# Altium project usb-pd-240w.PrjPcb
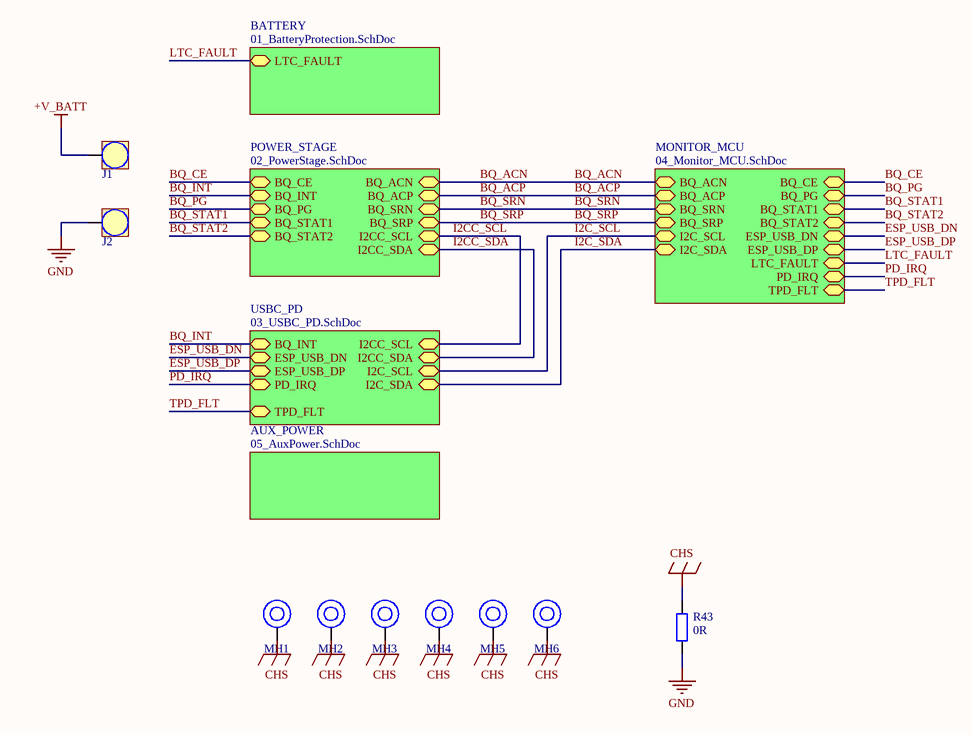
[diagram p0: 00_Top.SchDoc]
6 sheets, 154 parts. Net scope: hierarchical (ports join the sheet entries above them; power ports are global).
Board file: USB-PD-240W-PCB.PcbDoc
Sheets:
  00_Top.SchDoc
    BATTERY = 01_BatteryProtection.SchDoc
    POWER_STAGE = 02_PowerStage.SchDoc
    USBC_PD = 03_USBC_PD.SchDoc
    MONITOR_MCU = 04_Monitor_MCU.SchDoc
    AUX_POWER = 05_AuxPower.SchDoc

## Sheet 00_Top.SchDoc
size A3; SheetNumber: 1; SheetTotal: 6

### Parts
J1  7460408  [7460408_HAL Surface]  (value not drawn)
J2  7460408  [7460408_HAL Surface]  (value not drawn)
MH1  Mounting-Hole  [MH3.0x7.6]  (value not drawn)  (no BOM)
MH2  Mounting-Hole  [MH3.0x7.6]  (value not drawn)  (no BOM)
MH3  Mounting-Hole  [MH3.0x7.6]  (value not drawn)  (no BOM)
MH4  Mounting-Hole  [MH3.0x7.6]  (value not drawn)  (no BOM)
MH5  Mounting-Hole  [MH3.0x7.6]  (value not drawn)  (no BOM)
MH6  Mounting-Hole  [MH3.0x7.6]  (value not drawn)  (no BOM)
R43  0R  [RESC1608X06N]

### Sub-sheets
AUX_POWER = 05_AuxPower.SchDoc: no entries
BATTERY = 01_BatteryProtection.SchDoc: LTC_FAULT (bidir)
MONITOR_MCU = 04_Monitor_MCU.SchDoc: BQ_ACN (bidir), BQ_ACP (bidir), BQ_SRN (bidir), BQ_SRP (bidir), I2C_SCL (bidir), I2C_SDA (bidir), BQ_CE (bidir), BQ_PG (bidir), BQ_STAT1 (bidir), BQ_STAT2 (bidir), ESP_USB_DN (bidir), ESP_USB_DP (bidir), LTC_FAULT (bidir), PD_IRQ (bidir), TPD_FLT (bidir)
POWER_STAGE = 02_PowerStage.SchDoc: BQ_ACN (bidir), BQ_ACP (bidir), BQ_SRN (bidir), BQ_SRP (bidir), I2CC_SCL (bidir), I2CC_SDA (bidir), BQ_CE (bidir), BQ_INT (bidir), BQ_PG (bidir), BQ_STAT1 (bidir), BQ_STAT2 (bidir)
USBC_PD = 03_USBC_PD.SchDoc: I2CC_SCL (bidir), I2CC_SDA (bidir), I2C_SCL (bidir), I2C_SDA (bidir), BQ_INT (bidir), ESP_USB_DN (bidir), ESP_USB_DP (bidir), PD_IRQ (bidir), TPD_FLT (bidir)

### Nets
+V_BATT: J1.1
CHS: MH1.1 MH2.1 MH3.1 MH4.1 MH5.1 MH6.1 R43.2
GND: J2.1 R43.1
BQ_ACN: sheet POWER_STAGE/BQ_ACN, sheet MONITOR_MCU/BQ_ACN
BQ_ACP: sheet POWER_STAGE/BQ_ACP, sheet MONITOR_MCU/BQ_ACP
BQ_CE: sheet POWER_STAGE/BQ_CE, sheet MONITOR_MCU/BQ_CE
BQ_INT: sheet POWER_STAGE/BQ_INT, sheet USBC_PD/BQ_INT
BQ_PG: sheet POWER_STAGE/BQ_PG, sheet MONITOR_MCU/BQ_PG
BQ_SRN: sheet POWER_STAGE/BQ_SRN, sheet MONITOR_MCU/BQ_SRN
BQ_SRP: sheet POWER_STAGE/BQ_SRP, sheet MONITOR_MCU/BQ_SRP
BQ_STAT1: sheet POWER_STAGE/BQ_STAT1, sheet MONITOR_MCU/BQ_STAT1
BQ_STAT2: sheet POWER_STAGE/BQ_STAT2, sheet MONITOR_MCU/BQ_STAT2
ESP_USB_DN: sheet USBC_PD/ESP_USB_DN, sheet MONITOR_MCU/ESP_USB_DN
ESP_USB_DP: sheet USBC_PD/ESP_USB_DP, sheet MONITOR_MCU/ESP_USB_DP
I2C_SCL: sheet USBC_PD/I2C_SCL, sheet MONITOR_MCU/I2C_SCL
I2C_SDA: sheet USBC_PD/I2C_SDA, sheet MONITOR_MCU/I2C_SDA
I2CC_SCL: sheet POWER_STAGE/I2CC_SCL, sheet USBC_PD/I2CC_SCL
I2CC_SDA: sheet POWER_STAGE/I2CC_SDA, sheet USBC_PD/I2CC_SDA
LTC_FAULT: sheet BATTERY/LTC_FAULT, sheet MONITOR_MCU/LTC_FAULT
PD_IRQ: sheet USBC_PD/PD_IRQ, sheet MONITOR_MCU/PD_IRQ
TPD_FLT: sheet USBC_PD/TPD_FLT, sheet MONITOR_MCU/TPD_FLT

### Library data of the parts
J1 J2 = 7460408: TERM REDCUBE M5 12PIN PCB; Manufacturer 1: Würth Elektronik; Brand: Wurth; Case Style: M5Bush; Brand Number: 7460408; Order Code Supplier: 1821279; Price: 4,17; Supplier: Farnell; Part Name: 7460408; Supplier 1: Digi-Key; Supplier Part Number 1: 732-7460408-ND; Manufacturer Part Number 1: 7460408
MH1-MH6 = Mounting-Hole: MOUNTING HOLE 3.0x7.6MM; Part Name: Mounting-Hole
R43 = ERJ-3GEY0R00V: RES SMD 0 OHM JUMPER 1/10W 0603; Manufacturer 1: Panasonic Electronic Components; AEC-Q200: True; Power (Watts): 0.1W, 1/10W; Resistance: 0 Ohms; Case Code (Imperial): 0603; Manufacturer Part Number 1: ERJ-3GEY0R00V; Part Name: ERJ-3GEY0R00V; Supplier 1: Digi-Key; Supplier Part Number 1: P0.0GCT-ND; Tolerance: Jumper

## Sheet 01_BatteryProtection.SchDoc
size A3; SheetNumber: 2; SheetTotal: 6
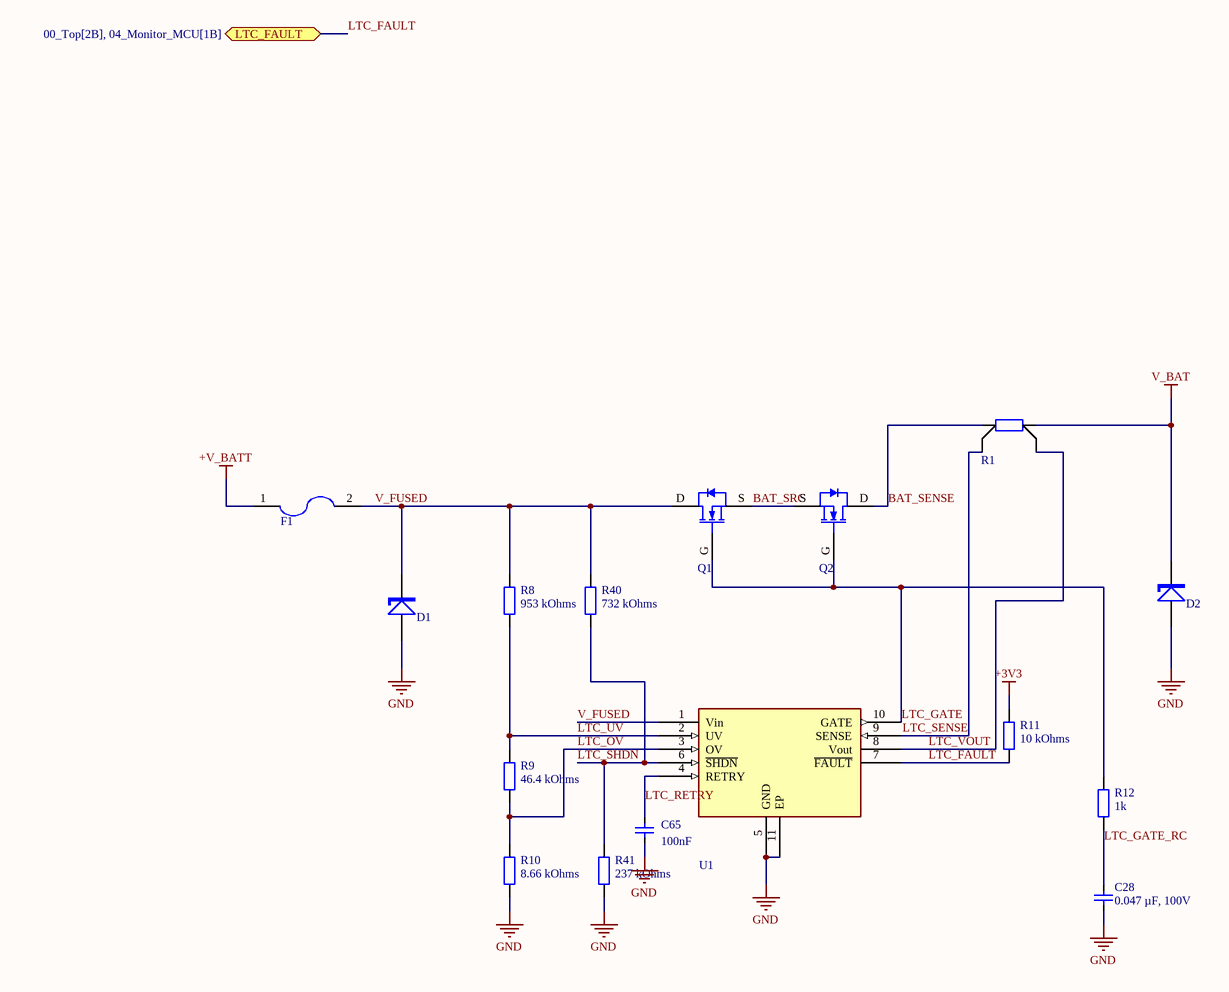
[diagram p1: 01_BatteryProtection.SchDoc]

### Parts
C28  0.047 µF, 100V  [CAPC1608X10N]
C65  100nF  [CAPC1608X10N]
D1  SMBJ60A  [SMB]  (value not drawn)
D2  SMBJ60A  [SMB]  (value not drawn)
F1  30A  [FUSE_BEL_0678H_3912]  (value not drawn)
Q1  ISC022N10NM6ATMA1  [INF-PG-TSON-8-3]  (value not drawn)
Q2  ISC022N10NM6ATMA1  [INF-PG-TSON-8-3]  (value not drawn)
R1  1.5m  [WSL3637]  (value not drawn)
R8  953 kOhms  [RESC1005X04N]
R9  46.4 kOhms  [RESC1005X04N]
R10  8.66 kOhms  [RESC1005X04N]
R11  10 kOhms  [RESC1005X04N]
R12  1k  [RESC1005X04N]
R40  732 kOhms  [RESC1005X04N]
R41  237 kOhms  [RESC1005X04N]
U1  LTC4368IDD-1#PBF  [LT-DD-DFN10_3X3]  (value not drawn)

### Ports
LTC_FAULT (bidir, see 00_Top[2B], 04_Monitor_MCU[1B])

### Nets
+3V3: R11.2
+V_BATT: F1.1
GND: C28.1 C65.1 D1.A D2.A R10.1 R41.1 U1.5(GND) U1.11(EP)
V_BAT: D2.K R1.2
BAT_SENSE: Q2.D(Drain) R1.1
BAT_SRC: Q1.S(Source) Q2.S(Source)
LTC_FAULT: R11.1 U1.7(~{FAULT}) ; port LTC_FAULT
LTC_GATE: Q1.G(Gate) Q2.G(Gate) R12.2 U1.10(GATE)
LTC_GATE_RC: C28.2 R12.1
LTC_OV: R9.1 R10.2 U1.3(OV)
LTC_RETRY: C65.2 U1.4(RETRY)
LTC_SENSE: R1.3 U1.9(SENSE)
LTC_SHDN: R40.1 R41.2 U1.6(~{SHDN})
LTC_UV: R8.1 R9.2 U1.2(UV)
LTC_VOUT: R1.4 U1.8(Vout)
V_FUSED: D1.K F1.2 Q1.D(Drain) R8.2 R40.2 U1.1(Vin)

### Library data of the parts
C28 = CGA3E3X7S2A473K080AB: CAP CER 0.047UF 100V X7S 0603; Manufacturer 1: TDK; AEC-Q200: True; Tolerance: ±10%; Capacitance: 0.047 µF; Case Code (Imperial): 0603; Manufacturer Part Number 1: CGA3E3X7S2A473K080AB; Mounting Type: Surface Mount, MLCC; Part Name: CGA3E3X7S2A473K080AB; Supplier 1: Digi-Key; Supplier Part Number 1: 445-6936-2-ND; Temperature Coefficient: X7S; Voltage Rating: 100V
C65 = CGA3E2X7R1H104M080AA: CAP CER 0.1UF 50V X7R 0603; Manufacturer 1: TDK Corporation; AEC-Q200: True; Capacitance: 0.1 µF; Tolerance: ±20%; Case Code (Imperial): 0603; Manufacturer Part Number 1: CGA3E2X7R1H104M080AA; Mounting Type: 0.063" L x 0.031" W (1.60mm x 0.80mm); Part Name: CGA3E2X7R1H104M080AA; Supplier 1: Digi-Key; Supplier Part Number 1: 445-12561-1-ND; Temperature Coefficient: X7R; Voltage Rating: 50V
D1 D2 = SMBJ60A: TVS DIODE 60VWM 96.8VC DO214AA; Manufacturer 1: Littelfuse Inc.; Diode Type: Zener; Current Average: 6.2A; Voltage Reverse: 66.7V; AEC-Q200: False; Part Name: SMBJ60A; Supplier 1: Digi-Key; Supplier Part Number 1: SMBJ60ALFTR-ND; Manufacturer Part Number 1: SMBJ60A; Voltage Forward: -; Package / Case: DO-214AA, SMB; Supplier Device Package: DO-214AA (SMBJ)
F1 = 0678H9300-02: FUSE BRD MT 30A 250VAC 125VDC; Manufacturer 1: Bel Fuse Inc.; Part Name: 0678H9300-02; Supplier 1: Digi-Key; Supplier Part Number 1: 5923-0678H9300-02TR-ND; Manufacturer Part Number 1: 0678H9300-02
Q1 Q2 = ISC022N10NM6ATMA1: TRENCH >=100V PG-TSON-8; Manufacturer 1: Infineon Technologies; FET Type: N-Channel; Drain to Source Voltage (Vdss): 100 V; Power Dissipation (Max): 3W (Ta), 254W (Tc); AEC-Q200: False; Part Name: ISC022N10NM6ATMA1; Supplier 1: Digi-Key; Supplier Part Number 1: 448-ISC022N10NM6ATMA1TR-ND; Manufacturer Part Number 1: ISC022N10NM6ATMA1; Package / Case: 8-PowerTDFN; Technology: MOSFET (Metal Oxide); Supplier Device Package: PG-TSON-8-3
R1 = WSL36371L500FEA: RES 0.0015 OHM 1% 3W 3637; Manufacturer 1: Vishay Dale; Resistance: 1.5 mOhms; AEC-Q200: True; Part Name: WSL36371L500FEA; Supplier 1: Digi-Key; Supplier Part Number 1: 541-10345-1-ND; Manufacturer Part Number 1: WSL36371L500FEA; Case Code (Imperial): 3637; Power (Watts): 3W; Tolerance: ±1%
R8 = ERJ-2RKF9533X: RES SMD 953K OHM 1% 1/10W 0402; Manufacturer 1: Panasonic Industry; Power (Watts): 0.1W, 1/10W; AEC-Q200: False; Part Name: ERJ-2RKF9533X; Supplier 1: Digi-Key; Supplier Part Number 1: P953KLTR-ND; Manufacturer Part Number 1: ERJ-2RKF9533X; Case Code (Imperial): 0402; Resistance: 953 kOhms; Tolerance: ±1%
R9 = ERJ-2RKF4642X: RES SMD 46.4K OHM 1% 1/10W 0402; Manufacturer 1: Panasonic Industry; Power (Watts): 0.1W, 1/10W; AEC-Q200: False; Part Name: ERJ-2RKF4642X; Supplier 1: Digi-Key; Supplier Part Number 1: P46.4KLTR-ND; Manufacturer Part Number 1: ERJ-2RKF4642X; Case Code (Imperial): 0402; Resistance: 46.4 kOhms; Tolerance: ±1%
R10 = ERJ-2RKF8661X: RES SMD 8.66K OHM 1% 1/10W 0402; Manufacturer 1: Panasonic Industry; Power (Watts): 0.1W, 1/10W; AEC-Q200: False; Part Name: ERJ-2RKF8661X; Supplier 1: Digi-Key; Supplier Part Number 1: P8.66KLTR-ND; Manufacturer Part Number 1: ERJ-2RKF8661X; Case Code (Imperial): 0402; Resistance: 8.66 kOhms; Tolerance: ±1%
R11 = ERJ-2RKF1002X: RES SMD 10K OHM 1% 1/10W 0402; Manufacturer 1: Panasonic Industry; Power (Watts): 0.1W, 1/10W; AEC-Q200: False; Part Name: ERJ-2RKF1002X; Supplier 1: Digi-Key; Supplier Part Number 1: P10.0KLTR-ND; Manufacturer Part Number 1: ERJ-2RKF1002X; Case Code (Imperial): 0402; Resistance: 10 kOhms; Tolerance: ±1%
R12 = ERJ-2RKF1001X: RES SMD 1K OHM 1% 1/10W 0402; Manufacturer 1: Panasonic Electronic Components; Resistance: 1 kOhms; Power (Watts): 0.1W, 1/10W; AEC-Q200: True; Part Name: ERJ-2RKF1001X; Supplier 1: Digi-Key; Supplier Part Number 1: P1.00KLCT-ND; Manufacturer Part Number 1: ERJ-2RKF1001X; Case Code (Imperial): 0402; Tolerance: ±1%
R40 = ERJ-2RKF7323X: RES SMD 732K OHM 1% 1/10W 0402; Manufacturer 1: Panasonic Industry; AEC-Q200: False; Power (Watts): 0.1W, 1/10W; Case Code (Imperial): 0402; Manufacturer Part Number 1: ERJ-2RKF7323X; Part Name: ERJ-2RKF7323X; Resistance: 732 kOhms; Supplier 1: Digi-Key; Supplier Part Number 1: P732KLTR-ND; Tolerance: ±1%
R41 = ERJ-2RKF2373X: RES SMD 237K OHM 1% 1/10W 0402; Manufacturer 1: Panasonic Industry; AEC-Q200: False; Power (Watts): 0.1W, 1/10W; Case Code (Imperial): 0402; Manufacturer Part Number 1: ERJ-2RKF2373X; Part Name: ERJ-2RKF2373X; Resistance: 237 kOhms; Supplier 1: Digi-Key; Supplier Part Number 1: P237KLTR-ND; Tolerance: ±1%
U1 = LTC4368IDD-1#PBF: IC SURGE SUPPRESSION ADJ 10DFN; Manufacturer 1: Analog Devices Inc.; AEC-Q200: False; Part Name: LTC4368IDD-1#PBF; Supplier 1: Digi-Key; Supplier Part Number 1: 505-LTC4368IDD-1#PBF-ND; Manufacturer Part Number 1: LTC4368IDD-1#PBF; Function: -; Package / Case: 10-WFDFN Exposed Pad; Supplier Device Package: 10-DFN (3x3)

## Sheet 02_PowerStage.SchDoc
size A3; SheetNumber: 3; SheetTotal: 6
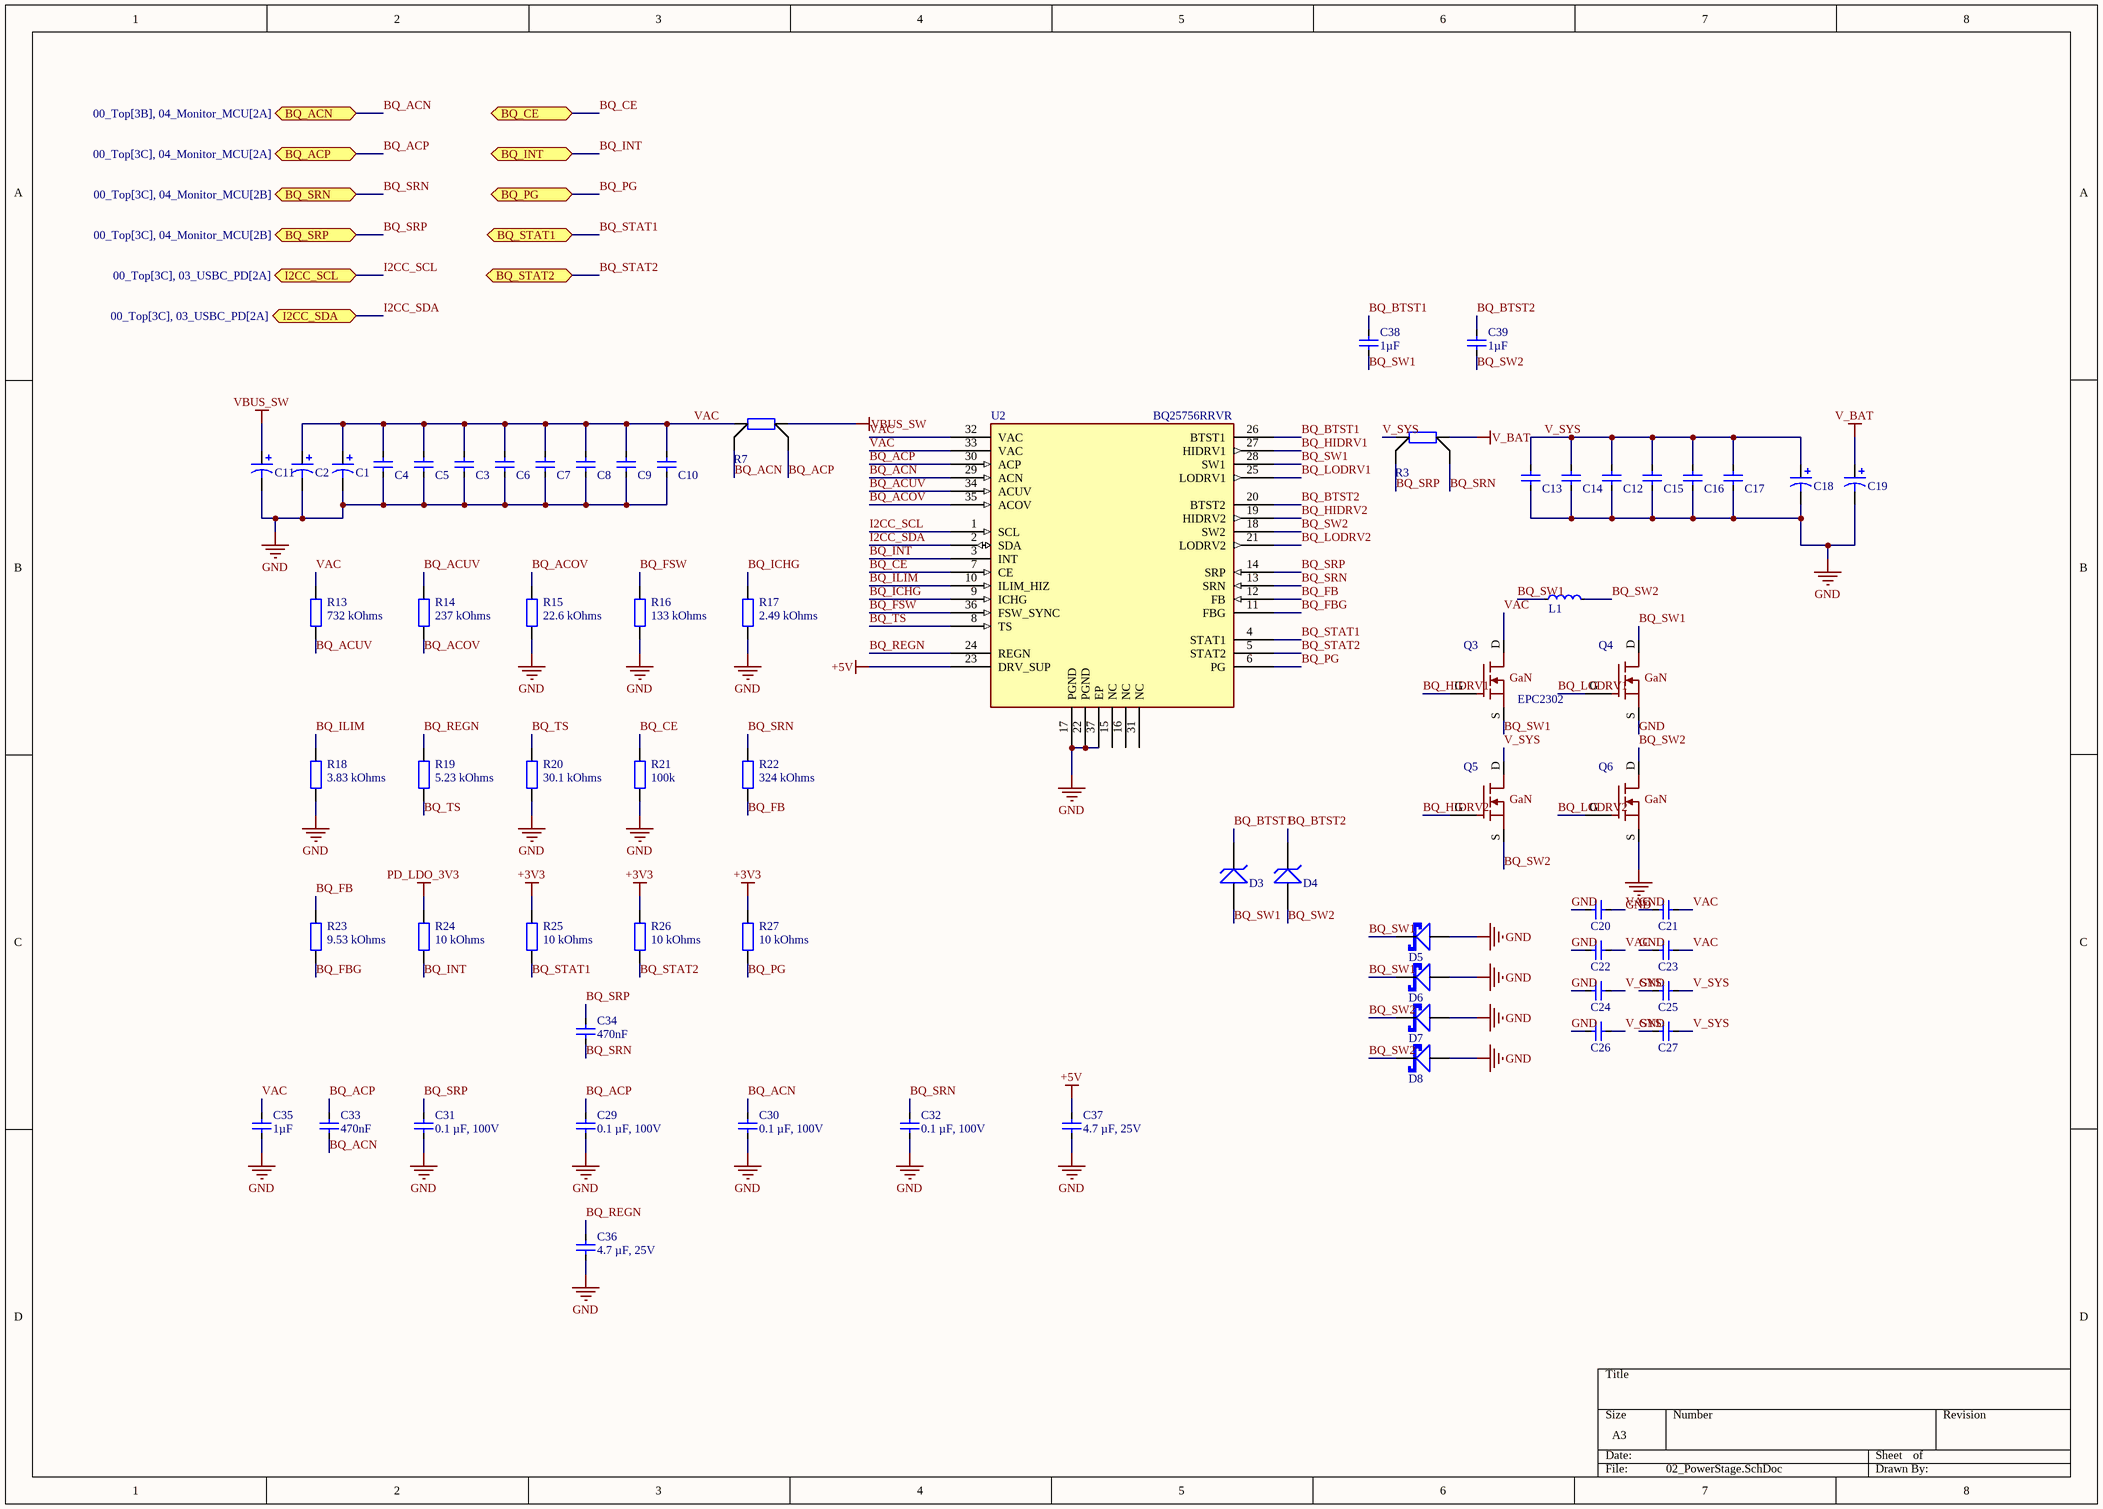
[diagram p2: 02_PowerStage.SchDoc]

### Parts
C1  100µF 80V  [CAPAE1030X1280N]  (value not drawn)
C2  100µF 80V  [CAPAE1030X1280N]  (value not drawn)
C3  10 µF, 100V  [CAPC3225X30N]  (value not drawn)
C4  10 µF, 100V  [CAPC3225X30N]  (value not drawn)
C5  10 µF, 100V  [CAPC3225X30N]  (value not drawn)
C6  10 µF, 100V  [CAPC3225X30N]  (value not drawn)
C7  10 µF, 100V  [CAPC3225X30N]  (value not drawn)
C8  10 µF, 100V  [CAPC3225X30N]  (value not drawn)
C9  10 µF, 100V  [CAPC3225X30N]  (value not drawn)
C10  10 µF, 100V  [CAPC3225X30N]  (value not drawn)
C11  100µF 80V  [CAPAE1030X1280N]  (value not drawn)
C12  10 µF, 100V  [CAPC3225X30N]  (value not drawn)
C13  10 µF, 100V  [CAPC3225X30N]  (value not drawn)
C14  10 µF, 100V  [CAPC3225X30N]  (value not drawn)
C15  10 µF, 100V  [CAPC3225X30N]  (value not drawn)
C16  10 µF, 100V  [CAPC3225X30N]  (value not drawn)
C17  10 µF, 100V  [CAPC3225X30N]  (value not drawn)
C18  100µF 80V  [CAPAE1030X1280N]  (value not drawn)
C19  100µF 80V  [CAPAE1030X1280N]  (value not drawn)
C20  0.1 µF, 100V  [CAPC1608X10N]  (value not drawn)
C21  10000 pF, 100V  [CAPC1608X10N]  (value not drawn)
C22  0.1 µF, 100V  [CAPC1608X10N]  (value not drawn)
C23  10000 pF, 100V  [CAPC1608X10N]  (value not drawn)
C24  0.1 µF, 100V  [CAPC1608X10N]  (value not drawn)
C25  10000 pF, 100V  [CAPC1608X10N]  (value not drawn)
C26  0.1 µF, 100V  [CAPC1608X10N]  (value not drawn)
C27  10000 pF, 100V  [CAPC1608X10N]  (value not drawn)
C29  0.1 µF, 100V  [CAPC1608X10N]
C30  0.1 µF, 100V  [CAPC1608X10N]
C31  0.1 µF, 100V  [CAPC1608X10N]
C32  0.1 µF, 100V  [CAPC1608X10N]
C33  470nF  [CAPC1608X10N]
C34  470nF  [CAPC1608X10N]
C35  1µF  [CAPC3216X20N]
C36  4.7 µF, 25V  [CAPC1608X10N]
C37  4.7 µF, 25V  [CAPC1608X10N]
C38  1µF  [CAPC1608X10N]
C39  1µF  [CAPC1608X10N]
D3  BZX384C5V6-G3-08  [NXP-SOD323]  (value not drawn)
D4  BZX384C5V6-G3-08  [NXP-SOD323]  (value not drawn)
D5  PMEG10030ELPX  [ST-SOD128FLAT]  (value not drawn)
D6  PMEG10030ELPX  [ST-SOD128FLAT]  (value not drawn)
D7  PMEG10030ELPX  [ST-SOD128FLAT]  (value not drawn)
D8  PMEG10030ELPX  [ST-SOD128FLAT]  (value not drawn)
L1  7uH  [WE-HCF_2013]  (value not drawn)
Q3  EPC2302  [TRANS_EPC2302]
Q4  EPC2302  [TRANS_EPC2302]  (value not drawn)
Q5  EPC2302  [TRANS_EPC2302]  (value not drawn)
Q6  EPC2302  [TRANS_EPC2302]  (value not drawn)
R3  5m  [2512-L-4T]  (value not drawn)
R7  5m  [2512-L-4T]  (value not drawn)
R13  732 kOhms  [RESC1005X04N]
R14  237 kOhms  [RESC1005X04N]
R15  22.6 kOhms  [RESC1005X04N]
R16  133 kOhms  [RESC1005X04N]
R17  2.49 kOhms  [RESC1005X04N]
R18  3.83 kOhms  [RESC1005X04N]
R19  5.23 kOhms  [RESC1005X04N]
R20  30.1 kOhms  [RESC1005X04N]
R21  100k  [RESC1005X04N]
R22  324 kOhms  [RESC1608X06N]
R23  9.53 kOhms  [RESC1005X04N]
R24  10 kOhms  [RESC1005X04N]
R25  10 kOhms  [RESC1005X04N]
R26  10 kOhms  [RESC1005X04N]
R27  10 kOhms  [RESC1005X04N]
U2  BQ25756RRVR  [QFN50P500X600X100-37N]

### Ports
BQ_ACN (bidir, see 00_Top[3B], 04_Monitor_MCU[2A]), BQ_ACP (bidir, see 00_Top[3C], 04_Monitor_MCU[2A]), BQ_CE (bidir), BQ_INT (bidir), BQ_PG (bidir), BQ_SRN (bidir, see 00_Top[3C], 04_Monitor_MCU[2B]), BQ_SRP (bidir, see 00_Top[3C], 04_Monitor_MCU[2B]), BQ_STAT1 (bidir), BQ_STAT2 (bidir), I2CC_SCL (bidir, see 00_Top[3C], 03_USBC_PD[2A]), I2CC_SDA (bidir, see 00_Top[3C], 03_USBC_PD[2A])

### Nets
+3V3: R25.2 R26.2 R27.2
+5V: C37.2 U2.23(DRV_SUP)
GND: C1.2 C2.2 C3.1 C4.1 C5.1 C6.1 C7.1 C8.1 C9.1 C10.1 C11.2 C12.1 C13.1 C14.1 C15.1 C16.1 C17.1 C18.2 C19.2 C20.1 C21.1 C22.1 C23.1 C24.1 C25.1 C26.1 C27.1 C29.1 C30.1 C31.1 C32.1 C35.1 C36.1 C37.1 D5.A D6.A D7.A D8.A Q4.S Q6.S R15.1 R16.1 R17.1 R18.1 R20.1 R21.1 U2.17(PGND) U2.22(PGND) U2.37(EP)
PD_LDO_3V3: R24.2
V_BAT: C19.1 R3.2
VBUS_SW: C11.1 R7.2
BQ_ACN: C30.2 C33.1 R7.3 U2.29(ACN) ; port BQ_ACN
BQ_ACOV: R14.1 R15.2 U2.35(ACOV)
BQ_ACP: C29.2 C33.2 R7.4 U2.30(ACP) ; port BQ_ACP
BQ_ACUV: R13.1 R14.2 U2.34(ACUV)
BQ_BTST1: C38.2 D3.K U2.26(BTST1)
BQ_BTST2: C39.2 D4.K U2.20(BTST2)
BQ_CE: R21.2 U2.7(CE) ; port BQ_CE
BQ_FB: R22.1 R23.2 U2.12(FB)
BQ_FBG: R23.1 U2.11(FBG)
BQ_FSW: R16.2 U2.36(FSW_SYNC)
BQ_HIDRV1: Q3.G U2.27(HIDRV1)
BQ_HIDRV2: Q5.G U2.19(HIDRV2)
BQ_ICHG: R17.2 U2.9(ICHG)
BQ_ILIM: R18.2 U2.10(ILIM_HIZ)
BQ_INT: R24.1 U2.3(INT) ; port BQ_INT
BQ_LODRV1: Q4.G U2.25(LODRV1)
BQ_LODRV2: Q6.G U2.21(LODRV2)
BQ_PG: R27.1 U2.6(PG) ; port BQ_PG
BQ_REGN: C36.2 R19.2 U2.24(REGN)
BQ_SRN: C32.2 C34.1 R3.4 R22.2 U2.13(SRN) ; port BQ_SRN
BQ_SRP: C31.2 C34.2 R3.3 U2.14(SRP) ; port BQ_SRP
BQ_STAT1: R25.1 U2.4(STAT1) ; port BQ_STAT1
BQ_STAT2: R26.1 U2.5(STAT2) ; port BQ_STAT2
BQ_SW1: C38.1 D3.A D5.K D6.K L1.1 Q3.S Q4.D U2.28(SW1)
BQ_SW2: C39.1 D4.A D7.K D8.K L1.2 Q5.S Q6.D U2.18(SW2)
BQ_TS: R19.1 R20.2 U2.8(TS)
I2CC_SCL: U2.1(SCL) ; port I2CC_SCL
I2CC_SDA: U2.2(SDA) ; port I2CC_SDA
V_SYS: C12.2 C13.2 C14.2 C15.2 C16.2 C17.2 C18.1 C24.2 C25.2 C26.2 C27.2 Q5.D R3.1
VAC: C1.1 C2.1 C3.2 C4.2 C5.2 C6.2 C7.2 C8.2 C9.2 C10.2 C20.2 C21.2 C22.2 C23.2 C35.2 Q3.D R7.1 R13.2 U2.32(VAC) U2.33(VAC)

Not connected (* = marked no-connect by the designer): U2 15(NC) 16(NC) 31(NC)

### Notes on the sheet
- (in symbol EPC2302) GaN

### Library data of the parts
C1 C2 C11 C18 C19 = B40910A0107M000: CAP ALUM POLY HYB 100UF 80V SMD; Manufacturer 1: TDK; Tolerance: ±20%; Temperature Coefficient: None; AEC-Q200: True; Part Name: B40910A0107M000; Supplier 1: Digi-Key; Supplier Part Number 1: 495-B40910A0107M000TR-ND; Manufacturer Part Number 1: B40910A0107M000; Case Code (Imperial): Radial, Can - SMD; Capacitance: 100 µF; Voltage Rating: 80 V; Mounting Type: Surface Mount
C3-C10 C12-C17 = GRM32EC72A106ME05L: CAP CER 10UF 100V X7S 1210; Manufacturer 1: Murata Electronics; Capacitance: 10 µF; Tolerance: ±20%; AEC-Q200: False; Part Name: GRM32EC72A106ME05L; Supplier 1: Digi-Key; Supplier Part Number 1: 490-GRM32EC72A106ME05LTR-ND; Manufacturer Part Number 1: GRM32EC72A106ME05L; Case Code (Imperial): 1210; Voltage Rating: 100V; Mounting Type: Surface Mount, MLCC; Temperature Coefficient: X7S
C20 C22 C24 C26 = CGA3E3X7S2A104K080AB: CAP CER 0.1UF 100V X7S 0603; Manufacturer 1: TDK; Capacitance: 0.1 µF; Tolerance: ±10%; AEC-Q200: True; Part Name: CGA3E3X7S2A104K080AB; Supplier 1: Digi-Key; Supplier Part Number 1: 445-6938-2-ND; Manufacturer Part Number 1: CGA3E3X7S2A104K080AB; Case Code (Imperial): 0603; Voltage Rating: 100V; Mounting Type: Surface Mount, MLCC; Temperature Coefficient: X7S
C21 C23 C25 C27 = C1608X7R2A103K080AA: CAP CER 10000PF 100V X7R 0603; Manufacturer 1: TDK; Tolerance: ±10%; AEC-Q200: False; Part Name: C1608X7R2A103K080AA; Supplier 1: Digi-Key; Supplier Part Number 1: 445-1304-2-ND; Manufacturer Part Number 1: C1608X7R2A103K080AA; Case Code (Imperial): 0603; Capacitance: 10000 pF; Voltage Rating: 100V; Mounting Type: Surface Mount, MLCC; Temperature Coefficient: X7R
C29-C32 = CGA3E3X7S2A104K080AB: CAP CER 0.1UF 100V X7S 0603; Manufacturer 1: TDK; AEC-Q200: True; Capacitance: 0.1 µF; Tolerance: ±10%; Case Code (Imperial): 0603; Manufacturer Part Number 1: CGA3E3X7S2A104K080AB; Mounting Type: Surface Mount, MLCC; Part Name: CGA3E3X7S2A104K080AB; Supplier 1: Digi-Key; Supplier Part Number 1: 445-6938-2-ND; Temperature Coefficient: X7S; Voltage Rating: 100V
C33 C34 = CGA3E3X7R1H474K080AB: CAP CER 0.47UF 50V X7R 0603; Manufacturer 1: TDK Corporation; AEC-Q200: True; Capacitance: 0.47 µF; Tolerance: ±10%; Case Code (Imperial): 0603; Manufacturer Part Number 1: CGA3E3X7R1H474K080AB; Mounting Type: Surface Mount, MLCC; Part Name: CGA3E3X7R1H474K080AB; Supplier 1: Digi-Key; Supplier Part Number 1: 445-175200-1-ND; Temperature Coefficient: X7R; Voltage Rating: 50V
C35 = CGA5L2X7R2A105M160AA: CAP CER 1UF 100V X7R 1206; Manufacturer 1: TDK Corporation; AEC-Q200: True; Tolerance: ±20%; Capacitance: 1 µF; Case Code (Imperial): 1206; Manufacturer Part Number 1: CGA5L2X7R2A105M160AA; Mounting Type: Surface Mount, MLCC; Part Name: CGA5L2X7R2A105M160AA; Supplier 1: Digi-Key; Supplier Part Number 1: 445-12901-1-ND; Temperature Coefficient: X7R; Voltage Rating: 100V
C36 C37 = GRT188C81E475KE13D: CAP CER 4.7UF 25V X6S 0603; Manufacturer 1: Murata Electronics; AEC-Q200: True; Capacitance: 4.7 µF; Tolerance: ±10%; Case Code (Imperial): 0603; Manufacturer Part Number 1: GRT188C81E475KE13D; Mounting Type: Surface Mount, MLCC; Part Name: GRT188C81E475KE13D; Supplier 1: Digi-Key; Supplier Part Number 1: 490-12295-2-ND; Temperature Coefficient: X6S; Voltage Rating: 25V
C38 C39 = CGA3E1X7R1C105M080AC: CAP CER 1UF 16V X7R 0603; Manufacturer 1: TDK Corporation; AEC-Q200: True; Tolerance: ±20%; Capacitance: 1 µF; Case Code (Imperial): 0603; Manufacturer Part Number 1: CGA3E1X7R1C105M080AC; Mounting Type: 0.063" L x 0.031" W (1.60mm x 0.80mm); Part Name: CGA3E1X7R1C105M080AC; Supplier 1: Digi-Key; Supplier Part Number 1: 445-12540-1-ND; Temperature Coefficient: X7R; Voltage Rating: 16V
D3 D4 = BZX384C5V6-G3-08: DIODE ZENER 5.6V 200MW SOD323; Manufacturer 1: Vishay General Semiconductor - Diodes Division; Diode Type: UKNOWN; Current Average: 1 µA @ 2 V; AEC-Q200: False; Part Name: BZX384C5V6-G3-08; Supplier 1: Digi-Key; Supplier Part Number 1: BZX384C5V6-G3-08GITR-ND; Manufacturer Part Number 1: BZX384C5V6-G3-08; Voltage Forward: -; Voltage Reverse: -; Package / Case: SC-76, SOD-323; Supplier Device Package: SOD-323
D5-D8 = PMEG10030ELPX: DIODE SCHOTTKY 100V 3A SOD128; Manufacturer 1: Nexperia USA Inc.; Voltage Forward: 770 mV @ 3 A; AEC-Q200: False; Part Name: PMEG10030ELPX; Supplier 1: Digi-Key; Supplier Part Number 1: 1727-2397-1-ND; Manufacturer Part Number 1: PMEG10030ELPX; Diode Type: Schottky; Current Average: 3A; Voltage Reverse: 100 V; Package / Case: SOD-128; Supplier Device Package: SOD-128/CFP5
L1 = 7443630700: FIXED IND 7UH 21A 5.61 MOHM SMD; Manufacturer 1: Würth Elektronik; Part Name: 7443630700; Supplier 1: Digi-Key; Supplier Part Number 1: 732-2519-2-ND; Manufacturer Part Number 1: 7443630700
Q3-Q6 = EPC2302: TRANS GAN 100V DIE .0018OHM; Manufacturer 1: EPC; FET Type: N-Channel; AEC-Q200: False; Part Name: EPC2302; Supplier 1: Digi-Key; Supplier Part Number 1: 917-EPC2302TR-ND; Manufacturer Part Number 1: EPC2302; Package / Case: 7-PowerWQFN; Technology: GaNFET (Gallium Nitride); Drain to Source Voltage (Vdss): 100 V; Supplier Device Package: 7-QFN (3x5); Power Dissipation (Max): -
R3 R7 = FC4L64R005FER: RES 0.005 OHM 2W 2512 WIDE; Manufacturer 1: Ohmite; Resistance: 5 mOhms; Tolerance: ±1%; AEC-Q200: False; Part Name: FC4L64R005FER; Supplier 1: Digi-Key; Supplier Part Number 1: FC4L64R005FERCT-ND; Manufacturer Part Number 1: FC4L64R005FER; Case Code (Imperial): 2512; Power (Watts): 2W
R13 = ERJ-2RKF7323X: RES SMD 732K OHM 1% 1/10W 0402; Manufacturer 1: Panasonic Industry; Power (Watts): 0.1W, 1/10W; AEC-Q200: False; Part Name: ERJ-2RKF7323X; Supplier 1: Digi-Key; Supplier Part Number 1: P732KLTR-ND; Manufacturer Part Number 1: ERJ-2RKF7323X; Case Code (Imperial): 0402; Resistance: 732 kOhms; Tolerance: ±1%
R14 = ERJ-2RKF2373X: RES SMD 237K OHM 1% 1/10W 0402; Manufacturer 1: Panasonic Industry; Power (Watts): 0.1W, 1/10W; AEC-Q200: False; Part Name: ERJ-2RKF2373X; Supplier 1: Digi-Key; Supplier Part Number 1: P237KLTR-ND; Manufacturer Part Number 1: ERJ-2RKF2373X; Case Code (Imperial): 0402; Resistance: 237 kOhms; Tolerance: ±1%
R15 = ERJ-2RKF2262X: RES SMD 22.6K OHM 1% 1/10W 0402; Manufacturer 1: Panasonic Industry; Power (Watts): 0.1W, 1/10W; AEC-Q200: False; Part Name: ERJ-2RKF2262X; Supplier 1: Digi-Key; Supplier Part Number 1: P22.6KLTR-ND; Manufacturer Part Number 1: ERJ-2RKF2262X; Case Code (Imperial): 0402; Resistance: 22.6 kOhms; Tolerance: ±1%
R16 = ERJ-2RKF1333X: RES SMD 133K OHM 1% 1/10W 0402; Manufacturer 1: Panasonic Industry; Power (Watts): 0.1W, 1/10W; AEC-Q200: False; Part Name: ERJ-2RKF1333X; Supplier 1: Digi-Key; Supplier Part Number 1: P133KLTR-ND; Manufacturer Part Number 1: ERJ-2RKF1333X; Case Code (Imperial): 0402; Resistance: 133 kOhms; Tolerance: ±1%
R17 = ERJ-2RKF2491X: RES SMD 2.49K OHM 1% 1/10W 0402; Manufacturer 1: Panasonic Industry; Power (Watts): 0.1W, 1/10W; AEC-Q200: False; Part Name: ERJ-2RKF2491X; Supplier 1: Digi-Key; Supplier Part Number 1: P2.49KLTR-ND; Manufacturer Part Number 1: ERJ-2RKF2491X; Case Code (Imperial): 0402; Resistance: 2.49 kOhms; Tolerance: ±1%
R18 = ERJ-2RKF3831X: RES SMD 3.83K OHM 1% 1/10W 0402; Manufacturer 1: Panasonic Industry; Power (Watts): 0.1W, 1/10W; AEC-Q200: False; Part Name: ERJ-2RKF3831X; Supplier 1: Digi-Key; Supplier Part Number 1: P3.83KLTR-ND; Manufacturer Part Number 1: ERJ-2RKF3831X; Case Code (Imperial): 0402; Resistance: 3.83 kOhms; Tolerance: ±1%
R19 = ERJ-2RKF5231X: RES SMD 5.23K OHM 1% 1/10W 0402; Manufacturer 1: Panasonic Industry; Power (Watts): 0.1W, 1/10W; AEC-Q200: False; Part Name: ERJ-2RKF5231X; Supplier 1: Digi-Key; Supplier Part Number 1: P5.23KLTR-ND; Manufacturer Part Number 1: ERJ-2RKF5231X; Case Code (Imperial): 0402; Resistance: 5.23 kOhms; Tolerance: ±1%
R20 = ERJ-2RKF3012X: RES SMD 30.1K OHM 1% 1/10W 0402; Manufacturer 1: Panasonic Industry; Power (Watts): 0.1W, 1/10W; AEC-Q200: False; Part Name: ERJ-2RKF3012X; Supplier 1: Digi-Key; Supplier Part Number 1: P30.1KLTR-ND; Manufacturer Part Number 1: ERJ-2RKF3012X; Case Code (Imperial): 0402; Resistance: 30.1 kOhms; Tolerance: ±1%
R21 = ERJ-2RKF1003X: RES SMD 100K OHM 1% 1/10W 0402; Manufacturer 1: Panasonic Electronic Components; Resistance: 100 kOhms; Power (Watts): 0.1W, 1/10W; AEC-Q200: True; Part Name: ERJ-2RKF1003X; Supplier 1: Digi-Key; Supplier Part Number 1: P100KLCT-ND; Manufacturer Part Number 1: ERJ-2RKF1003X; Case Code (Imperial): 0402; Tolerance: ±1%
R22 = ERA-3AEB3243V: RES SMD 324K OHM 0.1% 1/10W 0603; Manufacturer 1: Panasonic Industry; Power (Watts): 0.1W, 1/10W; AEC-Q200: False; Part Name: ERA-3AEB3243V; Supplier 1: Digi-Key; Supplier Part Number 1: P324KDBTR-ND; Manufacturer Part Number 1: ERA-3AEB3243V; Case Code (Imperial): 0603; Resistance: 324 kOhms; Tolerance: ±0.1%
R23 = ERA-2AEB9531X: RES SMD 9.53KOHM 0.1% 1/16W 0402; Manufacturer 1: Panasonic Industry; Power (Watts): 0.063W, 1/16W; AEC-Q200: False; Part Name: ERA-2AEB9531X; Supplier 1: Digi-Key; Supplier Part Number 1: P9.53KDCTR-ND; Manufacturer Part Number 1: ERA-2AEB9531X; Case Code (Imperial): 0402; Resistance: 9.53 kOhms; Tolerance: ±0.1%
R24-R27 = ERJ-2RKF1002X: as R11 on sheet 01_BatteryProtection; Part Name: ERJ-2RKF1002X; Supplier 1: Digi-Key; Supplier Part Number 1: P10.0KLTR-ND; Manufacturer Part Number 1: ERJ-2RKF1002X; Case Code (Imperial): 0402; Resistance: 10 kOhms; Tolerance: ±1%
U2 = BQ25756RRVR: STAND-ALONE OR IC CONTROLLED 70-; Manufacturer 1: Texas Instruments; AEC-Q200: False; Part Name: BQ25756RRVR; Supplier 1: Digi-Key; Supplier Part Number 1: 296-BQ25756RRVRTR-ND; Manufacturer Part Number 1: BQ25756RRVR; Function: -; Package / Case: 36-VFQFN Exposed Pad; Supplier Device Package: 36-VQFN (5x6)

## Sheet 03_USBC_PD.SchDoc
size A3; SheetNumber: 4; SheetTotal: 6
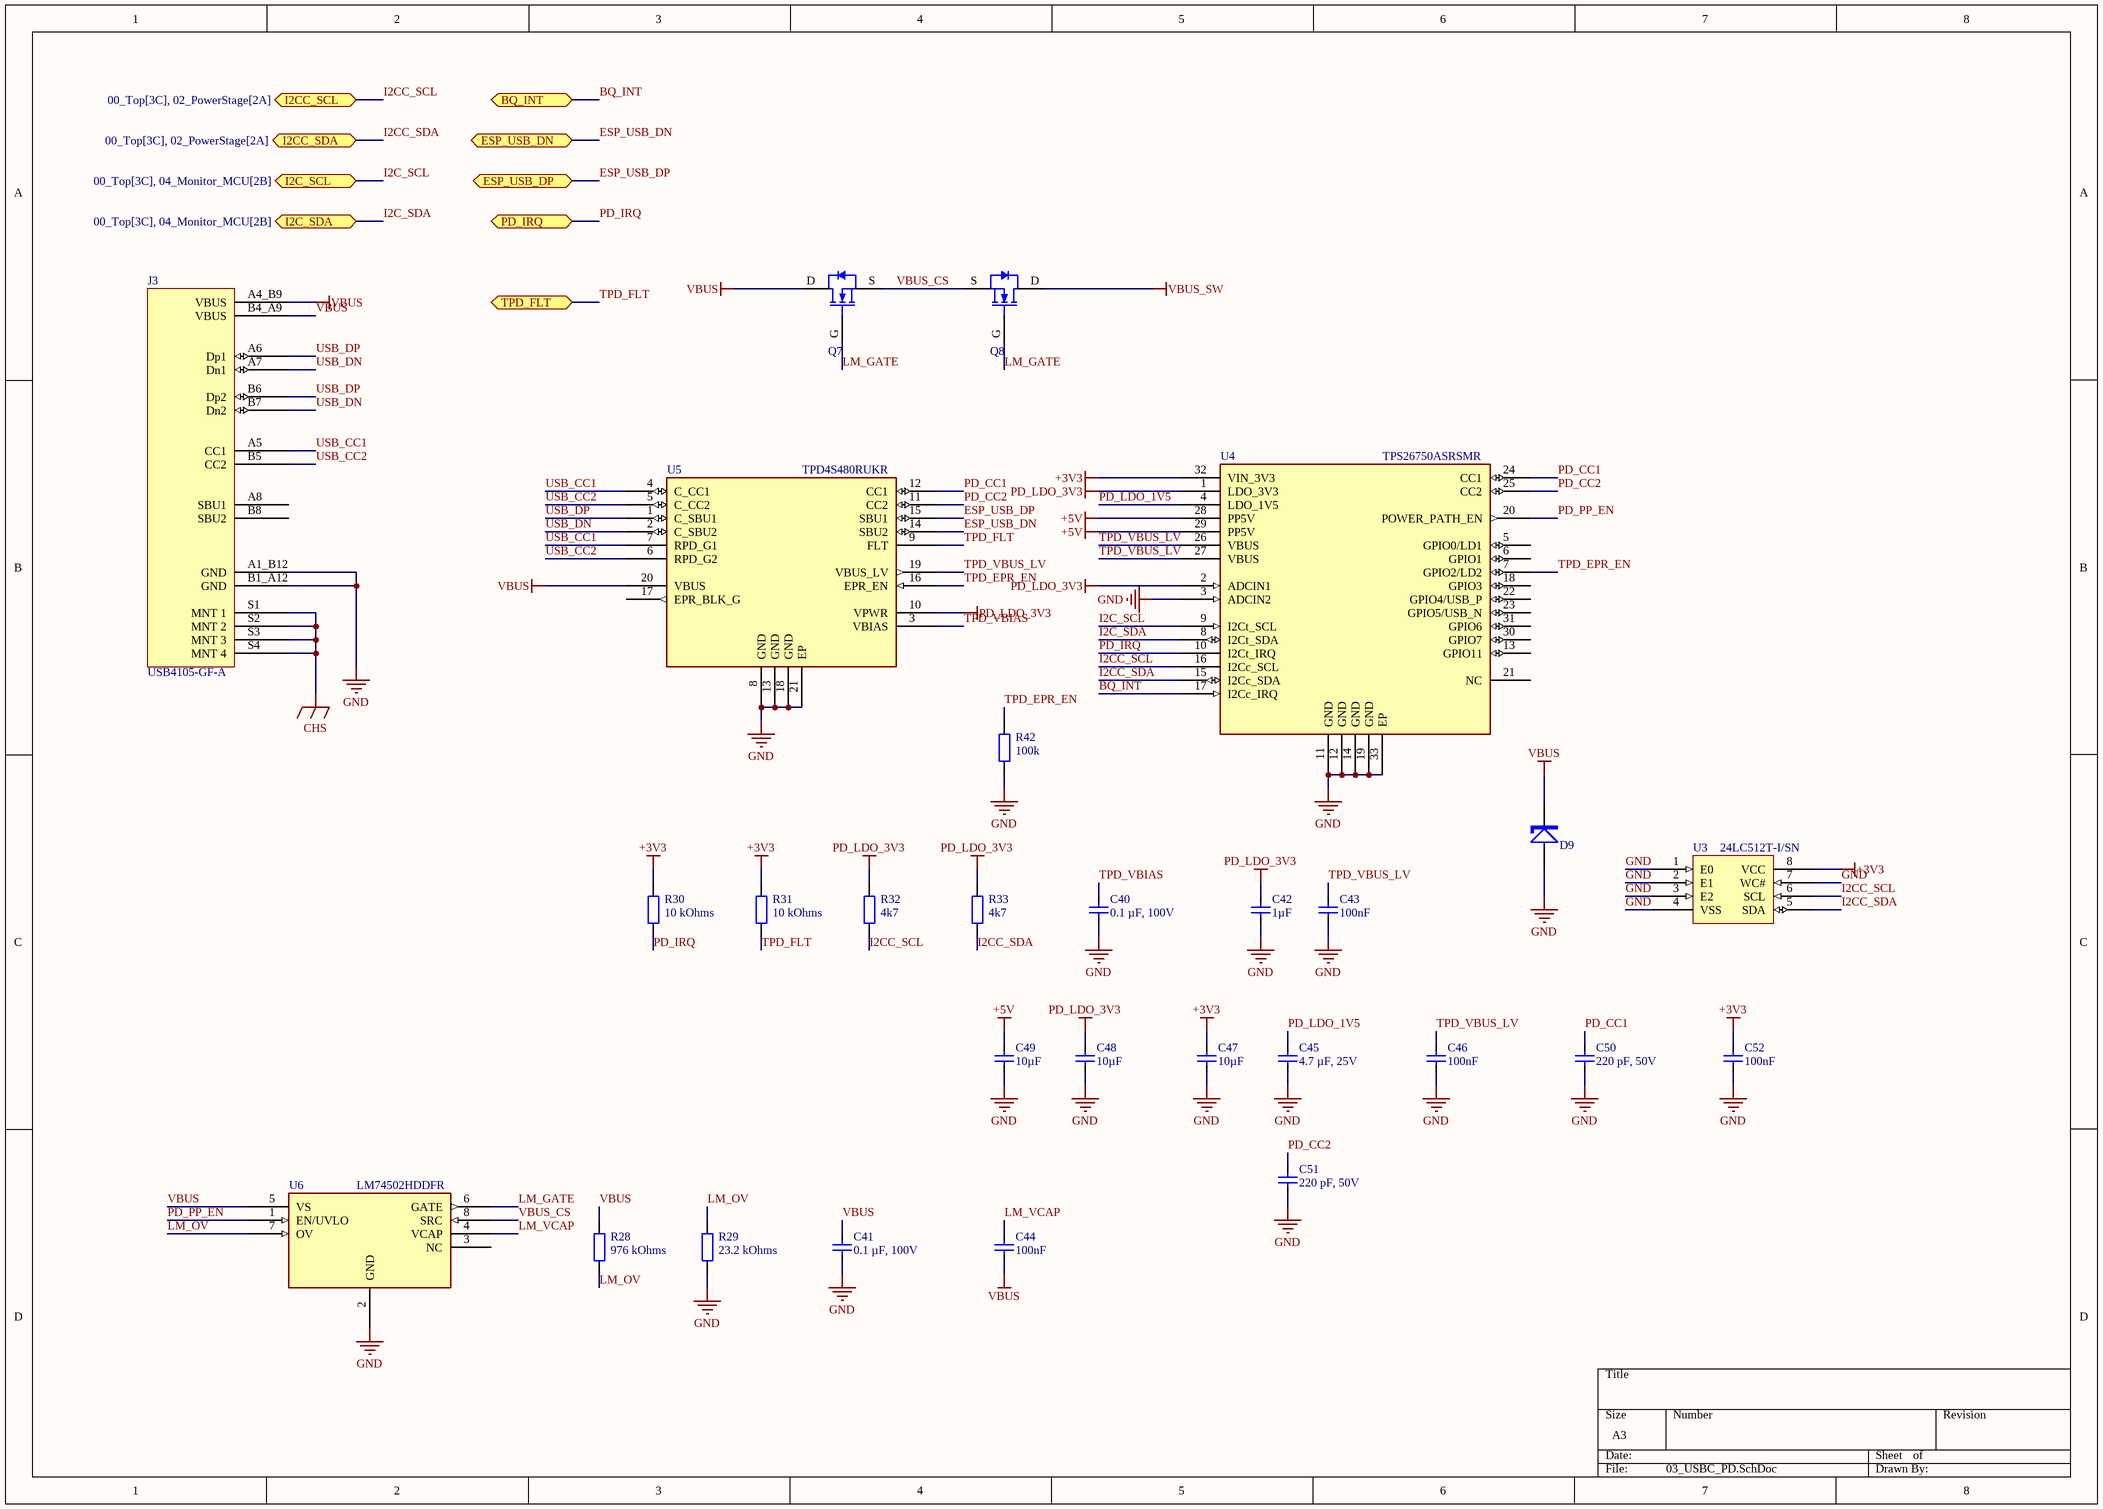
[diagram p3: 03_USBC_PD.SchDoc]

### Parts
C40  0.1 µF, 100V  [CAPC1608X10N]
C41  0.1 µF, 100V  [CAPC1608X10N]
C42  1µF  [CAPC1608X10N]
C43  100nF  [CAPC1608X10N]
C44  100nF  [CAPC1608X10N]
C45  4.7 µF, 25V  [CAPC2012X15N]
C46  100nF  [CAPC1608X10N]
C47  10µF  [CAPC2012X15N]
C48  10µF  [CAPC2012X15N]
C49  10µF  [CAPC2012X15N]
C50  220 pF, 50V  [CAPC1005X06N]
C51  220 pF, 50V  [CAPC1005X06N]
C52  100nF  [CAPC1005X06N]
D9  SMBJ54A  [SMB]  (value not drawn)
J3  USB4105-GF-A  [GCT_USB4105-GF-A]
Q7  BSZ097N10NS5ATMA1  [TRANS_PG-TSDSON-8]  (value not drawn)
Q8  BSZ097N10NS5ATMA1  [TRANS_PG-TSDSON-8]  (value not drawn)
R28  976 kOhms  [RESC1005X04N]
R29  23.2 kOhms  [RESC1005X04N]
R30  10 kOhms  [RESC1005X04N]
R31  10 kOhms  [RESC1005X04N]
R32  4k7  [RESC1005X04N]
R33  4k7  [RESC1005X04N]
R42  100k  [RESC1005X04N]
U3  24LC512T-I/SN  [SOIC127P600X175-8N]
U4  TPS26750ASRSMR  [TI-S-PVQFN-N32]
U5  TPD4S480RUKR  [QFN40P300X300X80-21N]
U6  LM74502HDDFR  [SOT65P280X100-8N]

### Ports
BQ_INT (bidir), ESP_USB_DN (bidir), ESP_USB_DP (bidir), I2C_SCL (bidir, see 00_Top[3C], 04_Monitor_MCU[2B]), I2C_SDA (bidir, see 00_Top[3C], 04_Monitor_MCU[2B]), I2CC_SCL (bidir, see 00_Top[3C], 02_PowerStage[2A]), I2CC_SDA (bidir, see 00_Top[3C], 02_PowerStage[2A]), PD_IRQ (bidir), TPD_FLT (bidir)

### Nets
+3V3: C47.2 C52.2 R30.2 R31.2 U3.8(VCC) U4.32(VIN_3V3)
+5V: C49.2 U4.28(PP5V) U4.29(PP5V)
CHS: J3.S1(MNT_1) J3.S2(MNT_2) J3.S3(MNT_3) J3.S4(MNT_4)
GND: C40.1 C41.1 C42.1 C43.1 C45.1 C46.1 C47.1 C48.1 C49.1 C50.1 C51.1 C52.1 D9.A J3.A1_B12(GND) J3.B1_A12(GND) R29.1 R42.1 U3.1(E0) U3.2(E1) U3.3(E2) U3.4(VSS) U3.7(WC#) U4.3(ADCIN2) U4.11(GND) U4.12(GND) U4.14(GND) U4.19(GND) U4.33(EP) U5.8(GND) U5.13(GND) U5.18(GND) U5.21(EP) U6.2(GND)
PD_LDO_3V3: C42.2 C48.2 R32.2 R33.2 U4.1(LDO_3V3) U4.2(ADCIN1) U5.10(VPWR)
VBUS: C41.2 C44.1 D9.K J3.A4_B9(VBUS) J3.B4_A9(VBUS) Q7.D(Drain) R28.2 U5.20(VBUS) U6.5(VS)
VBUS_SW: Q8.D(Drain)
BQ_INT: U4.17(I2Cc_IRQ) ; port BQ_INT
ESP_USB_DN: U5.14(SBU2) ; port ESP_USB_DN
ESP_USB_DP: U5.15(SBU1) ; port ESP_USB_DP
I2C_SCL: U4.9(I2Ct_SCL) ; port I2C_SCL
I2C_SDA: U4.8(I2Ct_SDA) ; port I2C_SDA
I2CC_SCL: R32.1 U3.6(SCL) U4.16(I2Cc_SCL) ; port I2CC_SCL
I2CC_SDA: R33.1 U3.5(SDA) U4.15(I2Cc_SDA) ; port I2CC_SDA
LM_GATE: Q7.G(Gate) Q8.G(Gate) U6.6(GATE)
LM_OV: R28.1 R29.2 U6.7(OV)
LM_VCAP: C44.2 U6.4(VCAP)
PD_CC1: C50.2 U4.24(CC1) U5.12(CC1)
PD_CC2: C51.2 U4.25(CC2) U5.11(CC2)
PD_IRQ: R30.1 U4.10(I2Ct_IRQ) ; port PD_IRQ
PD_LDO_1V5: C45.2 U4.4(LDO_1V5)
PD_PP_EN: U4.20(POWER_PATH_EN) U6.1(EN/UVLO)
TPD_EPR_EN: R42.2 U4.7(GPIO2/LD2) U5.16(EPR_EN)
TPD_FLT: R31.1 U5.9(FLT) ; port TPD_FLT
TPD_VBIAS: C40.2 U5.3(VBIAS)
TPD_VBUS_LV: C43.2 C46.2 U4.26(VBUS) U4.27(VBUS) U5.19(VBUS_LV)
USB_CC1: J3.A5(CC1) U5.4(C_CC1) U5.7(RPD_G1)
USB_CC2: J3.B5(CC2) U5.5(C_CC2) U5.6(RPD_G2)
USB_DN: J3.A7(Dn1) J3.B7(Dn2) U5.2(C_SBU2)
USB_DP: J3.A6(Dp1) J3.B6(Dp2) U5.1(C_SBU1)
VBUS_CS: Q7.S(Source) Q8.S(Source) U6.8(SRC)

Not connected (* = marked no-connect by the designer): J3 A8(SBU1) B8(SBU2); U4 5(GPIO0/LD1) 6(GPIO1) 13(GPIO11) 18(GPIO3) 21(NC) 22(GPIO4/USB_P) 23(GPIO5/USB_N) 30(GPIO7) 31(GPIO6); U5 17(EPR_BLK_G); U6 3(NC)

### Library data of the parts
C40 C41 = CGA3E3X7S2A104K080AB: as C29 on sheet 02_PowerStage; Case Code (Imperial): 0603; Manufacturer Part Number 1: CGA3E3X7S2A104K080AB; Mounting Type: Surface Mount, MLCC; Part Name: CGA3E3X7S2A104K080AB; Supplier 1: Digi-Key; Supplier Part Number 1: 445-6938-2-ND; Temperature Coefficient: X7S; Voltage Rating: 100V
C42 = CGA3E1X7R1C105M080AC: as C38 on sheet 02_PowerStage; Capacitance: 1 µF; Case Code (Imperial): 0603; Manufacturer Part Number 1: CGA3E1X7R1C105M080AC; Mounting Type: 0.063" L x 0.031" W (1.60mm x 0.80mm); Part Name: CGA3E1X7R1C105M080AC; Supplier 1: Digi-Key; Supplier Part Number 1: 445-12540-1-ND; Temperature Coefficient: X7R; Voltage Rating: 16V
C43 C44 C46 = CGA3E2X7R1H104M080AA: as C65 on sheet 01_BatteryProtection; Case Code (Imperial): 0603; Manufacturer Part Number 1: CGA3E2X7R1H104M080AA; Mounting Type: 0.063" L x 0.031" W (1.60mm x 0.80mm); Part Name: CGA3E2X7R1H104M080AA; Supplier 1: Digi-Key; Supplier Part Number 1: 445-12561-1-ND; Temperature Coefficient: X7R; Voltage Rating: 50V
C45 = CGA4J1X7R1E475K125AC: CAP CER 4.7UF 25V X7R 0805; Manufacturer 1: TDK; AEC-Q200: True; Capacitance: 4.7 µF; Tolerance: ±10%; Case Code (Imperial): 0805; Manufacturer Part Number 1: CGA4J1X7R1E475K125AC; Mounting Type: Surface Mount, MLCC; Part Name: CGA4J1X7R1E475K125AC; Supplier 1: Digi-Key; Supplier Part Number 1: 445-6967-2-ND; Temperature Coefficient: X7R; Voltage Rating: 25V
C47-C49 = CGA4J1X7S1C106K125AC: CAP CER 10UF 16V X7S 0805; Manufacturer 1: TDK Corporation; AEC-Q200: True; Tolerance: ±10%; Capacitance: 10 µF; Case Code (Imperial): 0805; Manufacturer Part Number 1: CGA4J1X7S1C106K125AC; Mounting Type: Surface Mount, MLCC; Part Name: CGA4J1X7S1C106K125AC; Supplier 1: Digi-Key; Supplier Part Number 1: 445-16110-1-ND; Temperature Coefficient: X7S; Voltage Rating: 16V
C50 C51 = CGA2B2C0G1H221J050BA: CAP CER 220PF 50V C0G/NP0 0402; Manufacturer 1: TDK Corporation; AEC-Q200: True; Temperature Coefficient: C0G, NP0; Tolerance: ±5%; Capacitance: 220 pF; Case Code (Imperial): 0402; Manufacturer Part Number 1: CGA2B2C0G1H221J050BA; Mounting Type: Surface Mount, MLCC; Part Name: CGA2B2C0G1H221J050BA; Supplier 1: Digi-Key; Voltage Rating: 50V
C52 = CGA2B1X7R1C104K050BC: CAP CER 0.1UF 16V X7R 0402; Manufacturer 1: TDK Corporation; AEC-Q200: True; Capacitance: 0.1 µF; Tolerance: ±10%; Case Code (Imperial): 0402; Manufacturer Part Number 1: CGA2B1X7R1C104K050BC; Mounting Type: Surface Mount, MLCC; Part Name: CGA2B1X7R1C104K050BC; Supplier 1: Digi-Key; Supplier Part Number 1: 445-5613-1-ND; Temperature Coefficient: X7R; Voltage Rating: 16V
D9 = SMBJ54A: TVS DIODE 54VWM 87.1VC DO214AA; Manufacturer 1: Littelfuse Inc.; Diode Type: Zener; Current Average: 6.9A; Voltage Reverse: 60V; AEC-Q200: False; Part Name: SMBJ54A; Supplier 1: Digi-Key; Supplier Part Number 1: SMBJ54ALFTR-ND; Manufacturer Part Number 1: SMBJ54A; Voltage Forward: -; Package / Case: DO-214AA, SMB; Supplier Device Package: DO-214AA (SMBJ)
J3 = USB4105-GF-A: CONN RCP USB2.0 TYP C 24P SMD RA; Manufacturer 1: GCT; Value: *; Availability: Unavailable; Price: None; Package: None; MP: USB4105-GF-A; Part Name: USB4105-GF-A; Supplier 1: Digi-Key; Supplier Part Number 1: 2073-USB4105-GF-ACT-ND; Manufacturer Part Number 1: USB4105-GF-A
Q7 Q8 = BSZ097N10NS5ATMA1: MOSFET N-CH 100V 8A/40A TSDSON; Manufacturer 1: Infineon Technologies; FET Type: N-Channel; Power Dissipation (Max): 2.1W (Ta), 69W (Tc); AEC-Q200: False; Part Name: BSZ097N10NS5ATMA1; Supplier 1: Digi-Key; Supplier Part Number 1: BSZ097N10NS5ATMA1TR-ND; Manufacturer Part Number 1: BSZ097N10NS5ATMA1; Package / Case: 8-PowerTDFN; Technology: MOSFET (Metal Oxide); Drain to Source Voltage (Vdss): 100 V; Supplier Device Package: PG-TSDSON-8-FL
R28 = ERJ-2RKF9763X: RES SMD 976K OHM 1% 1/10W 0402; Manufacturer 1: Panasonic Industry; Power (Watts): 0.1W, 1/10W; AEC-Q200: False; Part Name: ERJ-2RKF9763X; Supplier 1: Digi-Key; Supplier Part Number 1: P976KLTR-ND; Manufacturer Part Number 1: ERJ-2RKF9763X; Case Code (Imperial): 0402; Resistance: 976 kOhms; Tolerance: ±1%
R29 = ERJ-2RKF2322X: RES SMD 23.2K OHM 1% 1/10W 0402; Manufacturer 1: Panasonic Industry; Power (Watts): 0.1W, 1/10W; AEC-Q200: False; Part Name: ERJ-2RKF2322X; Supplier 1: Digi-Key; Supplier Part Number 1: P23.2KLTR-ND; Manufacturer Part Number 1: ERJ-2RKF2322X; Case Code (Imperial): 0402; Resistance: 23.2 kOhms; Tolerance: ±1%
R30 R31 = ERJ-2RKF1002X: as R11 on sheet 01_BatteryProtection; Part Name: ERJ-2RKF1002X; Supplier 1: Digi-Key; Supplier Part Number 1: P10.0KLTR-ND; Manufacturer Part Number 1: ERJ-2RKF1002X; Case Code (Imperial): 0402; Resistance: 10 kOhms; Tolerance: ±1%
R32 R33 = ERJ-2RKF4701X: RES SMD 4.7K OHM 1% 1/10W 0402; Manufacturer 1: Panasonic Electronic Components; Resistance: 4.7 kOhms; Power (Watts): 0.1W, 1/10W; AEC-Q200: True; Part Name: ERJ-2RKF4701X; Supplier 1: Digi-Key; Supplier Part Number 1: P4.70KLCT-ND; Manufacturer Part Number 1: ERJ-2RKF4701X; Case Code (Imperial): 0402; Tolerance: ±1%
R42 = ERJ-2RKF1003X: RES SMD 100K OHM 1% 1/10W 0402; Manufacturer 1: Panasonic Electronic Components; AEC-Q200: True; Power (Watts): 0.1W, 1/10W; Resistance: 100 kOhms; Case Code (Imperial): 0402; Manufacturer Part Number 1: ERJ-2RKF1003X; Part Name: ERJ-2RKF1003X; Supplier 1: Digi-Key; Supplier Part Number 1: P100KLCT-ND; Tolerance: ±1%
U3 = 24LC512T-I/SN: IC EEPROM 512KBIT I2C 8SOIC; Manufacturer 1: Microchip Technology; AEC-Q200: False; Part Name: 24LC512T-I/SN; Supplier 1: Digi-Key; Supplier Part Number 1: 24LC512T-I/SNTR-ND; Manufacturer Part Number 1: 24LC512T-I/SN; Function: -; Package / Case: 8-SOIC (0.154", 3.90mm Width); Supplier Device Package: 8-SOIC
U4 = TPS26750ASRSMR: CNTRLR/SW USB-C/PD3.2 32VQFN; Manufacturer 1: Texas Instruments; Function: USB, Type-C Controller; AEC-Q200: False; Part Name: TPS26750ASRSMR; Supplier 1: Digi-Key; Supplier Part Number 1: 296-TPS26750ASRSMRTR-ND; Manufacturer Part Number 1: TPS26750ASRSMR; Package / Case: 32-VFQFN Exposed Pad; Supplier Device Package: 32-VQFN (4x4)
U5 = TPD4S480RUKR: USB TYPE-C 48V EPR PORT PROTECTO; Manufacturer 1: Texas Instruments; Function: USB Type C; AEC-Q200: False; Part Name: TPD4S480RUKR; Supplier 1: Digi-Key; Supplier Part Number 1: 296-TPD4S480RUKRTR-ND; Manufacturer Part Number 1: TPD4S480RUKR; Package / Case: 20-WFQFN Exposed Pad; Supplier Device Package: 20-WQFN (3x3)
U6 = LM74502HDDFR: 3.2-V TO 65-V INDUSTRIAL RPP CON; Manufacturer 1: Texas Instruments; Function: Reverse polarity / OV protection controller; AEC-Q200: False; Part Name: LM74502HDDFR; Supplier 1: Digi-Key; Supplier Part Number 1: 296-LM74502HDDFRTR-ND; Manufacturer Part Number 1: LM74502HDDFR; Package / Case: SOT-23-8 Thin, TSOT-23-8; Supplier Device Package: TSOT-23-8

## Sheet 04_Monitor_MCU.SchDoc
size A3; SheetNumber: 5; SheetTotal: 6
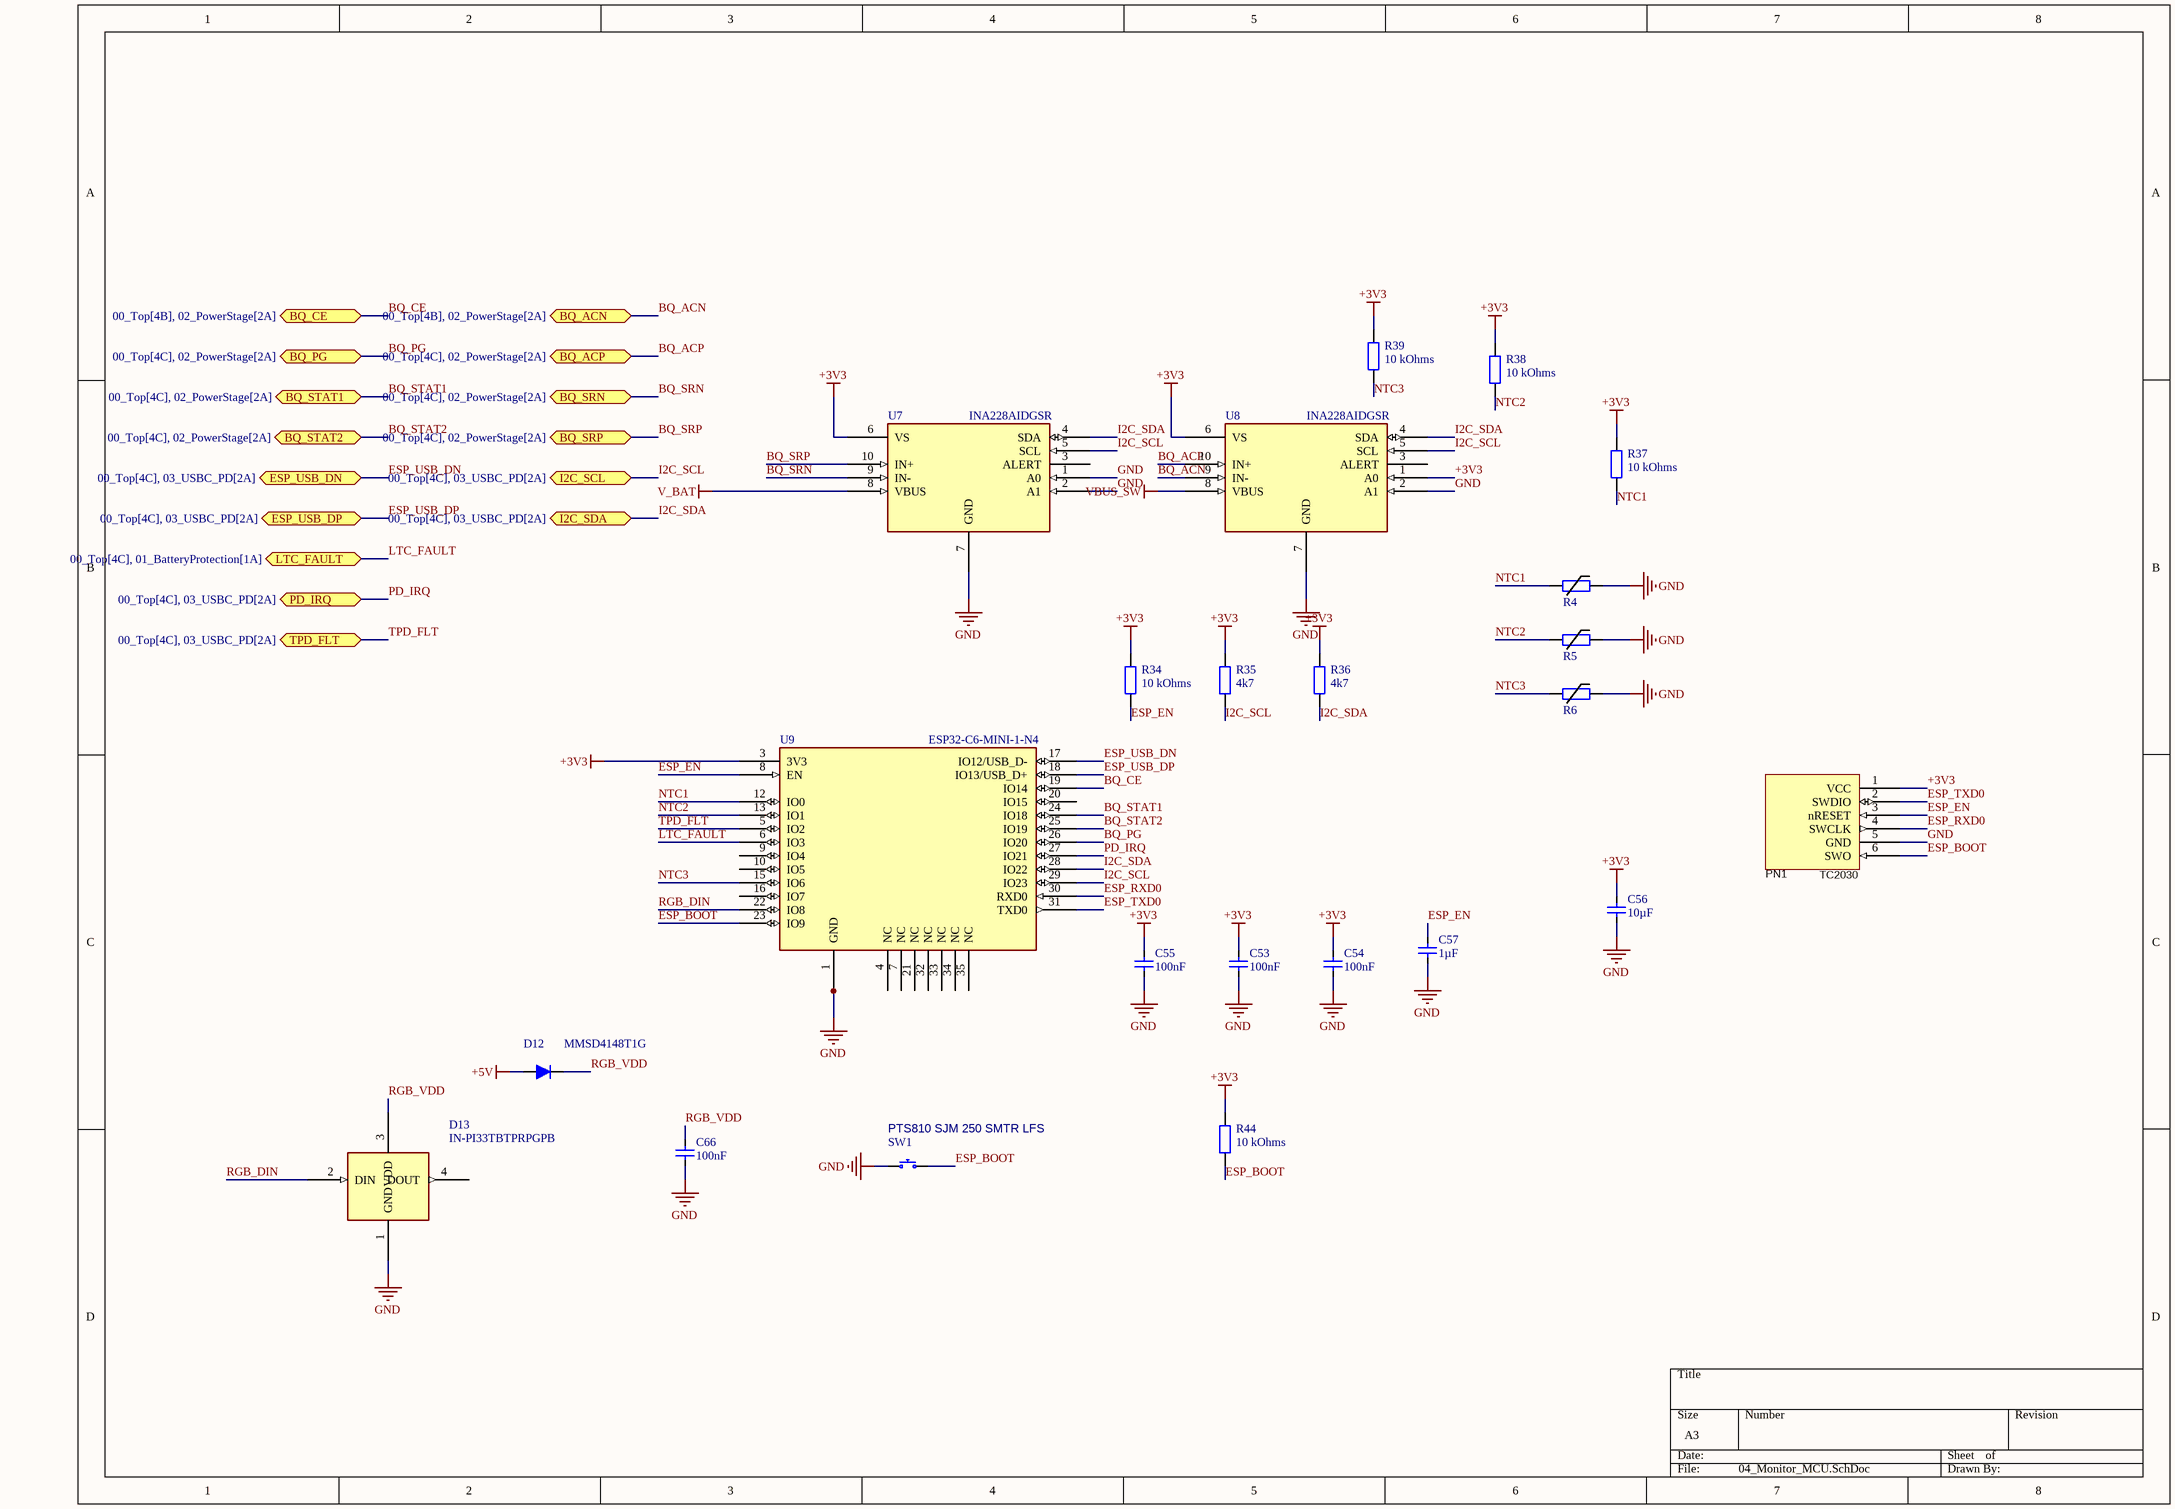
[diagram p4: 04_Monitor_MCU.SchDoc]

### Parts
C53  100nF  [CAPC1005X06N]
C54  100nF  [CAPC1005X06N]
C55  100nF  [CAPC1005X06N]
C56  10µF  [CAPC2012X15N]
C57  1µF  [CAPC1608X10N]
C66  100nF  [CAPC1005X06N]
D12  MMSD4148T1G  [SOD3716X135N]
D13  IN-PI33TBTPRPGPB  [LED_RGB_3535_ADDR]
PN1  TC2030  [TC2030-MCP-NL-SINGLE]  (no BOM)
R4  NTC 10K  [RESC1608X06N]  (value not drawn)
R5  NTC 10K  [RESC1608X06N]  (value not drawn)
R6  NTC 10K  [RESC1608X06N]  (value not drawn)
R34  10 kOhms  [RESC1005X04N]
R35  4k7  [RESC1005X04N]
R36  4k7  [RESC1005X04N]
R37  10 kOhms  [RESC1005X04N]
R38  10 kOhms  [RESC1005X04N]
R39  10 kOhms  [RESC1005X04N]
R44  10 kOhms  [RESC1005X04N]
SW1  PTS810 SJM 250 SMTR LFS  [C&K_PTS810]
U7  INA228AIDGSR  [MSOP10]
U8  INA228AIDGSR  [MSOP10]
U9  ESP32-C6-MINI-1-N4  [ESP32-C6-MINI-1-N4]

### Ports
BQ_ACN (bidir, see 00_Top[4B], 02_PowerStage[2A]), BQ_ACP (bidir, see 00_Top[4C], 02_PowerStage[2A]), BQ_CE (bidir, see 00_Top[4B], 02_PowerStage[2A]), BQ_PG (bidir, see 00_Top[4C], 02_PowerStage[2A]), BQ_SRN (bidir, see 00_Top[4C], 02_PowerStage[2A]), BQ_SRP (bidir, see 00_Top[4C], 02_PowerStage[2A]), BQ_STAT1 (bidir, see 00_Top[4C], 02_PowerStage[2A]), BQ_STAT2 (bidir, see 00_Top[4C], 02_PowerStage[2A]), ESP_USB_DN (bidir, see 00_Top[4C], 03_USBC_PD[2A]), ESP_USB_DP (bidir, see 00_Top[4C], 03_USBC_PD[2A]), I2C_SCL (bidir, see 00_Top[4C], 03_USBC_PD[2A]), I2C_SDA (bidir, see 00_Top[4C], 03_USBC_PD[2A]), LTC_FAULT (bidir, see 00_Top[4C], 01_BatteryProtection[1A]), PD_IRQ (bidir, see 00_Top[4C], 03_USBC_PD[2A]), TPD_FLT (bidir, see 00_Top[4C], 03_USBC_PD[2A])

### Nets
+3V3: C53.2 C54.2 C55.2 C56.2 PN1.1(VCC) R34.2 R35.2 R36.2 R37.2 R38.2 R39.2 R44.2 U7.6(VS) U8.1(A0) U8.6(VS) U9.3(3V3)
+5V: D12.A
GND: C53.1 C54.1 C55.1 C56.1 C57.1 C66.1 D13.1(GND) PN1.5(GND) R4.2 R5.2 R6.2 SW1.2(COM) U7.1(A0) U7.2(A1) U7.7(GND) U8.2(A1) U8.7(GND) U9.1(GND) U9.2(GND) U9.11(GND) U9.14(GND) U9.36(GND) U9.37(GND) U9.38(GND) U9.39(GND) U9.40(GND) U9.41(GND) U9.42(GND) U9.43(GND) U9.44(GND) U9.45(GND) U9.46(GND) U9.47(GND) U9.48(GND) U9.49(GND) U9.50(GND) U9.51(GND) U9.52(GND) U9.53(GND)
V_BAT: U7.8(VBUS)
VBUS_SW: U8.8(VBUS)
BQ_ACN: U8.9(IN-) ; port BQ_ACN
BQ_ACP: U8.10(IN+) ; port BQ_ACP
BQ_CE: U9.19(IO14) ; port BQ_CE
BQ_PG: U9.26(IO20) ; port BQ_PG
BQ_SRN: U7.9(IN-) ; port BQ_SRN
BQ_SRP: U7.10(IN+) ; port BQ_SRP
BQ_STAT1: U9.24(IO18) ; port BQ_STAT1
BQ_STAT2: U9.25(IO19) ; port BQ_STAT2
ESP_BOOT: PN1.6(SWO) R44.1 SW1.1(N.O) U9.23(IO9)
ESP_EN: C57.2 PN1.3(nRESET) R34.1 U9.8(EN)
ESP_RXD0: PN1.4(SWCLK) U9.30(RXD0)
ESP_TXD0: PN1.2(SWDIO) U9.31(TXD0)
ESP_USB_DN: U9.17(IO12/USB_D-) ; port ESP_USB_DN
ESP_USB_DP: U9.18(IO13/USB_D+) ; port ESP_USB_DP
I2C_SCL: R35.1 U7.5(SCL) U8.5(SCL) U9.29(IO23) ; port I2C_SCL
I2C_SDA: R36.1 U7.4(SDA) U8.4(SDA) U9.28(IO22) ; port I2C_SDA
LTC_FAULT: U9.6(IO3) ; port LTC_FAULT
NTC1: R4.1 R37.1 U9.12(IO0)
NTC2: R5.1 R38.1 U9.13(IO1)
NTC3: R6.1 R39.1 U9.15(IO6)
PD_IRQ: U9.27(IO21) ; port PD_IRQ
RGB_DIN: D13.2(DIN) U9.22(IO8)
RGB_VDD: C66.2 D12.K D13.3(VDD)
TPD_FLT: U9.5(IO2) ; port TPD_FLT

Not connected (* = marked no-connect by the designer): D13 4(DOUT); U7 3(ALERT); U8 3(ALERT); U9 4(NC) 7(NC) 9(IO4) 10(IO5) 16(IO7) 20(IO15) 21(NC) 32(NC) 33(NC) 34(NC) 35(NC)

### Library data of the parts
C53-C55 C66 = CGA2B1X7R1C104K050BC: as C52 on sheet 03_USBC_PD; Case Code (Imperial): 0402; Manufacturer Part Number 1: CGA2B1X7R1C104K050BC; Mounting Type: Surface Mount, MLCC; Part Name: CGA2B1X7R1C104K050BC; Supplier 1: Digi-Key; Supplier Part Number 1: 445-5613-1-ND; Temperature Coefficient: X7R; Voltage Rating: 16V
C56 = CGA4J1X7S1C106K125AC: as C47 on sheet 03_USBC_PD; Capacitance: 10 µF; Case Code (Imperial): 0805; Manufacturer Part Number 1: CGA4J1X7S1C106K125AC; Mounting Type: Surface Mount, MLCC; Part Name: CGA4J1X7S1C106K125AC; Supplier 1: Digi-Key; Supplier Part Number 1: 445-16110-1-ND; Temperature Coefficient: X7S; Voltage Rating: 16V
C57 = CGA3E1X7R1C105M080AC: as C38 on sheet 02_PowerStage; Capacitance: 1 µF; Case Code (Imperial): 0603; Manufacturer Part Number 1: CGA3E1X7R1C105M080AC; Mounting Type: 0.063" L x 0.031" W (1.60mm x 0.80mm); Part Name: CGA3E1X7R1C105M080AC; Supplier 1: Digi-Key; Supplier Part Number 1: 445-12540-1-ND; Temperature Coefficient: X7R; Voltage Rating: 16V
D12 = MMSD4148T1G: DIODE GEN PURP 100V 200MA SOD123; Manufacturer 1: onsemi; AEC-Q200: False; Diode Type: Standard; Voltage Forward: 1 V @ 10 mA; Current Average: 200mA; Manufacturer Part Number 1: MMSD4148T1G; Package / Case: SOD-123; Part Name: MMSD4148T1G; Supplier 1: Digi-Key; Supplier Device Package: SOD-123; Supplier Part Number 1: MMSD4148T1GOSCT-ND; Voltage Reverse: 100 V
D13 = IN-PI33TBTPRPGPB: ADDRESS LED DISCRETE SERIAL RGB; Manufacturer 1: Inolux; AEC-Q200: False; Current Average: 12mA Red, 12mA Green, 12mA Blue; Diode Type: LED (addressable); Voltage Forward: VDD 3.5-5.5 V; Manufacturer Part Number 1: IN-PI33TBTPRPGPB; Package / Case: 4-PLCC, 3535; Part Name: IN-PI33TBTPRPGPB; Supplier 1: Digi-Key; Supplier Device Package: -; Supplier Part Number 1: 1830-1208-1-ND; Voltage Reverse: -
PN1 = TC2030-MCP-NL-SINGLE: TAG CONNECT 2030 6 PIN; Part Name: TC2030-MCP-NL-SINGLE; Supplier 1: None; Supplier Part Number 1: TC2030; Manufacturer 1: Tag Connect; Manufacturer Part Number 1: TC2030
R4-R6 = NTCS0603E3103FMT: THERMISTOR NTC 10KOHM 3610K 0603; Manufacturer 1: Vishay Beyschlag/Draloric/BC Components; Resistance: 10 kOhms; Power (Watts): 0.125W, 1/8W; Tolerance: ±1%; AEC-Q200: True; Part Name: NTCS0603E3103FMT; Supplier 1: Digi-Key; Supplier Part Number 1: BC2472TR-ND; Manufacturer Part Number 1: NTCS0603E3103FMT; Case Code (Imperial): 0603
R34 = ERJ-2RKF1002X: as R11 on sheet 01_BatteryProtection; Part Name: ERJ-2RKF1002X; Supplier 1: Digi-Key; Supplier Part Number 1: P10.0KLTR-ND; Manufacturer Part Number 1: ERJ-2RKF1002X; Case Code (Imperial): 0402; Resistance: 10 kOhms; Tolerance: ±1%
R35 R36 = ERJ-2RKF4701X: as R32 on sheet 03_USBC_PD; Part Name: ERJ-2RKF4701X; Supplier 1: Digi-Key; Supplier Part Number 1: P4.70KLCT-ND; Manufacturer Part Number 1: ERJ-2RKF4701X; Case Code (Imperial): 0402; Tolerance: ±1%
R37-R39 R44 = ERJ-2RKF1002X: RES SMD 10K OHM 1% 1/10W 0402; Manufacturer 1: Panasonic Industry; AEC-Q200: False; Power (Watts): 0.1W, 1/10W; Case Code (Imperial): 0402; Manufacturer Part Number 1: ERJ-2RKF1002X; Part Name: ERJ-2RKF1002X; Resistance: 10 kOhms; Supplier 1: Digi-Key; Supplier Part Number 1: P10.0KLTR-ND; Tolerance: ±1%
SW1 = PTS810 SJM 250 SMTR LFS: SWITCH TACTILE SPST-NO 0.05A 16V; Manufacturer 1: C&K; Manufacturer Part Number 1: PTS810 SJM 250 SMTR LFS; Part Name: PTS810 SJM 250 SMTR LFS; Supplier 1: Digi-Key; Supplier Part Number 1: CKN10502CT-ND
U7 U8 = INA228AIDGSR: IC PWR MONITOR 10VSSOP; Manufacturer 1: Texas Instruments; Function: Digital Power Monitor; AEC-Q200: False; Part Name: INA228AIDGSR; Supplier 1: Digi-Key; Supplier Part Number 1: 296-INA228AIDGSRTR-ND; Manufacturer Part Number 1: INA228AIDGSR; Package / Case: 10-TFSOP, 10-MSOP (0.118", 3.00mm Width); Supplier Device Package: 10-VSSOP
U9 = ESP32-C6-MINI-1-N4: RF TXRX MOD BT WIFI PCB TH SMD; Manufacturer 1: Espressif Systems; AEC-Q200: False; Part Name: ESP32-C6-MINI-1-N4; Supplier 1: Digi-Key; Supplier Part Number 1: 1965-ESP32-C6-MINI-1-N4TR-ND; Manufacturer Part Number 1: ESP32-C6-MINI-1-N4; Function: -; Package / Case: 53-SMD Module; Supplier Device Package: -

## Sheet 05_AuxPower.SchDoc
size A3; SheetNumber: 6; SheetTotal: 6
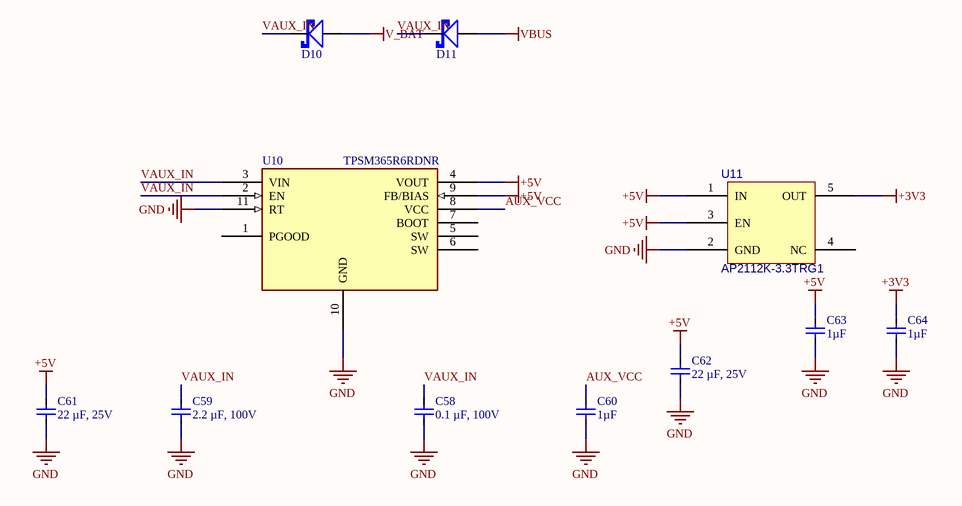
[diagram p5: 05_AuxPower.SchDoc]

### Parts
C58  0.1 µF, 100V  [CAPC1608X10N]
C59  2.2 µF, 100V  [CAPC3216X20N]
C60  1µF  [CAPC1608X10N]
C61  22 µF, 25V  [CAPC3225X30N]
C62  22 µF, 25V  [CAPC3225X30N]
C63  1µF  [CAPC1608X10N]
C64  1µF  [CAPC1608X10N]
D10  PMEG10030ELPX  [ST-SOD128FLAT]  (value not drawn)
D11  PMEG10030ELPX  [ST-SOD128FLAT]  (value not drawn)
U10  TPSM365R6RDNR  [TI-RDN0011A]
U11  AP2112K-3.3TRG1  [SOT95P280X145-5N]

### Nets
+3V3: C64.2 U11.5(OUT)
+5V: C61.2 C62.2 C63.2 U10.4(VOUT) U10.9(FB/BIAS) U11.1(IN) U11.3(EN)
GND: C58.1 C59.1 C60.1 C61.1 C62.1 C63.1 C64.1 U10.10(GND) U10.11(RT) U11.2(GND)
V_BAT: D10.A
VBUS: D11.A
AUX_VCC: C60.2 U10.8(VCC)
VAUX_IN: C58.2 C59.2 D10.K D11.K U10.2(EN) U10.3(VIN)

Not connected (* = marked no-connect by the designer): U10 1(PGOOD) 5(SW) 6(SW) 7(BOOT); U11 4(NC)

### Library data of the parts
C58 = CGA3E3X7S2A104K080AB: as C29 on sheet 02_PowerStage; Case Code (Imperial): 0603; Manufacturer Part Number 1: CGA3E3X7S2A104K080AB; Mounting Type: Surface Mount, MLCC; Part Name: CGA3E3X7S2A104K080AB; Supplier 1: Digi-Key; Supplier Part Number 1: 445-6938-2-ND; Temperature Coefficient: X7S; Voltage Rating: 100V
C59 = CGA5L3X7S2A225K160AB: CAP CER 2.2UF 100V X7S 1206; Manufacturer 1: TDK Corporation; AEC-Q200: True; Capacitance: 2.2 µF; Tolerance: ±10%; Case Code (Imperial): 1206; Manufacturer Part Number 1: CGA5L3X7S2A225K160AB; Mounting Type: Surface Mount, MLCC; Part Name: CGA5L3X7S2A225K160AB; Supplier 1: Digi-Key; Temperature Coefficient: X7S; Voltage Rating: 100V
C60 C63 C64 = CGA3E1X7R1C105M080AC: as C38 on sheet 02_PowerStage; Capacitance: 1 µF; Case Code (Imperial): 0603; Manufacturer Part Number 1: CGA3E1X7R1C105M080AC; Mounting Type: 0.063" L x 0.031" W (1.60mm x 0.80mm); Part Name: CGA3E1X7R1C105M080AC; Supplier 1: Digi-Key; Supplier Part Number 1: 445-12540-1-ND; Temperature Coefficient: X7R; Voltage Rating: 16V
C61 C62 = CGA6P3X7R1E226M250AB: CAP CER 22UF 25V X7R 1210; Manufacturer 1: TDK; AEC-Q200: True; Capacitance: 22 µF; Tolerance: ±20%; Case Code (Imperial): 1210; Manufacturer Part Number 1: CGA6P3X7R1E226M250AB; Mounting Type: Surface Mount, MLCC; Part Name: CGA6P3X7R1E226M250AB; Supplier 1: Digi-Key; Supplier Part Number 1: 445-180363-2-ND; Temperature Coefficient: X7R; Voltage Rating: 25V
D10 D11 = PMEG10030ELPX: as D5 on sheet 02_PowerStage; Part Name: PMEG10030ELPX; Supplier 1: Digi-Key; Supplier Part Number 1: 1727-2397-1-ND; Manufacturer Part Number 1: PMEG10030ELPX; Diode Type: Schottky; Current Average: 3A; Voltage Reverse: 100 V; Package / Case: SOD-128; Supplier Device Package: SOD-128/CFP5
U10 = TPSM365R6RDNR: 3-V TO 65-V INPUT, 1-V TO 13-V O; Manufacturer 1: Texas Instruments; Function: Buck power module 3-65V in, 600mA; AEC-Q200: False; Part Name: TPSM365R6RDNR; Supplier 1: Digi-Key; Supplier Part Number 1: 296-TPSM365R6RDNRTR-ND; Manufacturer Part Number 1: TPSM365R6RDNR; Package / Case: 11-PowerVFQFN Module; Supplier Device Package: 11-QFN-FCMOD (3.5x4.5)
U11 = AP2112K-3.3TRG1: IC REG LINEAR 3.3V 600MA SOT25; Manufacturer 1: Diodes Incorporated; AEC-Q200: False; Part Name: AP2112K-3.3TRG1; Supplier 1: Digi-Key; Supplier Part Number 1: AP2112K-3.3TRG1DICT-ND; Manufacturer Part Number 1: AP2112K-3.3TRG1; Function: -; Package / Case: SC-74A, SOT-753; Supplier Device Package: SOT-25

## Nets that join several sheets
+3V3: 01_BatteryProtection (R11.2), 02_PowerStage (R25.2 R26.2 R27.2), 03_USBC_PD (6 pins), 04_Monitor_MCU (16 pins), 05_AuxPower (C64.2 U11.5)
+5V: 02_PowerStage (C37.2 U2.23), 03_USBC_PD (C49.2 U4.28 U4.29), 04_Monitor_MCU (D12.A), 05_AuxPower (7 pins)
+V_BATT: 00_Top (J1.1), 01_BatteryProtection (F1.1)
CHS: 00_Top (7 pins), 03_USBC_PD (J3.S1 J3.S2 J3.S3 J3.S4)
GND: 00_Top (J2.1 R43.1), 01_BatteryProtection (8 pins), 02_PowerStage (49 pins), 03_USBC_PD (33 pins), 04_Monitor_MCU (39 pins), 05_AuxPower (10 pins)
PD_LDO_3V3: 02_PowerStage (R24.2), 03_USBC_PD (7 pins)
V_BAT: 01_BatteryProtection (D2.K R1.2), 02_PowerStage (C19.1 R3.2), 04_Monitor_MCU (U7.8), 05_AuxPower (D10.A)
VBUS: 03_USBC_PD (9 pins), 05_AuxPower (D11.A)
VBUS_SW: 02_PowerStage (C11.1 R7.2), 03_USBC_PD (Q8.D), 04_Monitor_MCU (U8.8)
BQ_ACN: 02_PowerStage (C30.2 C33.1 R7.3 U2.29), 04_Monitor_MCU (U8.9)
BQ_ACP: 02_PowerStage (C29.2 C33.2 R7.4 U2.30), 04_Monitor_MCU (U8.10)
BQ_CE: 02_PowerStage (R21.2 U2.7), 04_Monitor_MCU (U9.19)
BQ_INT: 02_PowerStage (R24.1 U2.3), 03_USBC_PD (U4.17)
BQ_PG: 02_PowerStage (R27.1 U2.6), 04_Monitor_MCU (U9.26)
BQ_SRN: 02_PowerStage (5 pins), 04_Monitor_MCU (U7.9)
BQ_SRP: 02_PowerStage (C31.2 C34.2 R3.3 U2.14), 04_Monitor_MCU (U7.10)
BQ_STAT1: 02_PowerStage (R25.1 U2.4), 04_Monitor_MCU (U9.24)
BQ_STAT2: 02_PowerStage (R26.1 U2.5), 04_Monitor_MCU (U9.25)
ESP_USB_DN: 03_USBC_PD (U5.14), 04_Monitor_MCU (U9.17)
ESP_USB_DP: 03_USBC_PD (U5.15), 04_Monitor_MCU (U9.18)
I2C_SCL: 03_USBC_PD (U4.9), 04_Monitor_MCU (R35.1 U7.5 U8.5 U9.29)
I2C_SDA: 03_USBC_PD (U4.8), 04_Monitor_MCU (R36.1 U7.4 U8.4 U9.28)
I2CC_SCL: 02_PowerStage (U2.1), 03_USBC_PD (R32.1 U3.6 U4.16)
I2CC_SDA: 02_PowerStage (U2.2), 03_USBC_PD (R33.1 U3.5 U4.15)
LTC_FAULT: 01_BatteryProtection (R11.1 U1.7), 04_Monitor_MCU (U9.6)
PD_IRQ: 03_USBC_PD (R30.1 U4.10), 04_Monitor_MCU (U9.27)
TPD_FLT: 03_USBC_PD (R31.1 U5.9), 04_Monitor_MCU (U9.5)

## Assembly variants
12V-4S-LFP: all parts fitted
24V-8S-LFP: all parts fitted
48V-13S-NMC: all parts fitted
48V-16S-LFP: all parts fitted